# EAGLE schematic RobotRacers_RevQ (EAGLE 9.7.0)

## Sheet 1 of 14: MODULO / ALIMENTACION / ARRANQUE
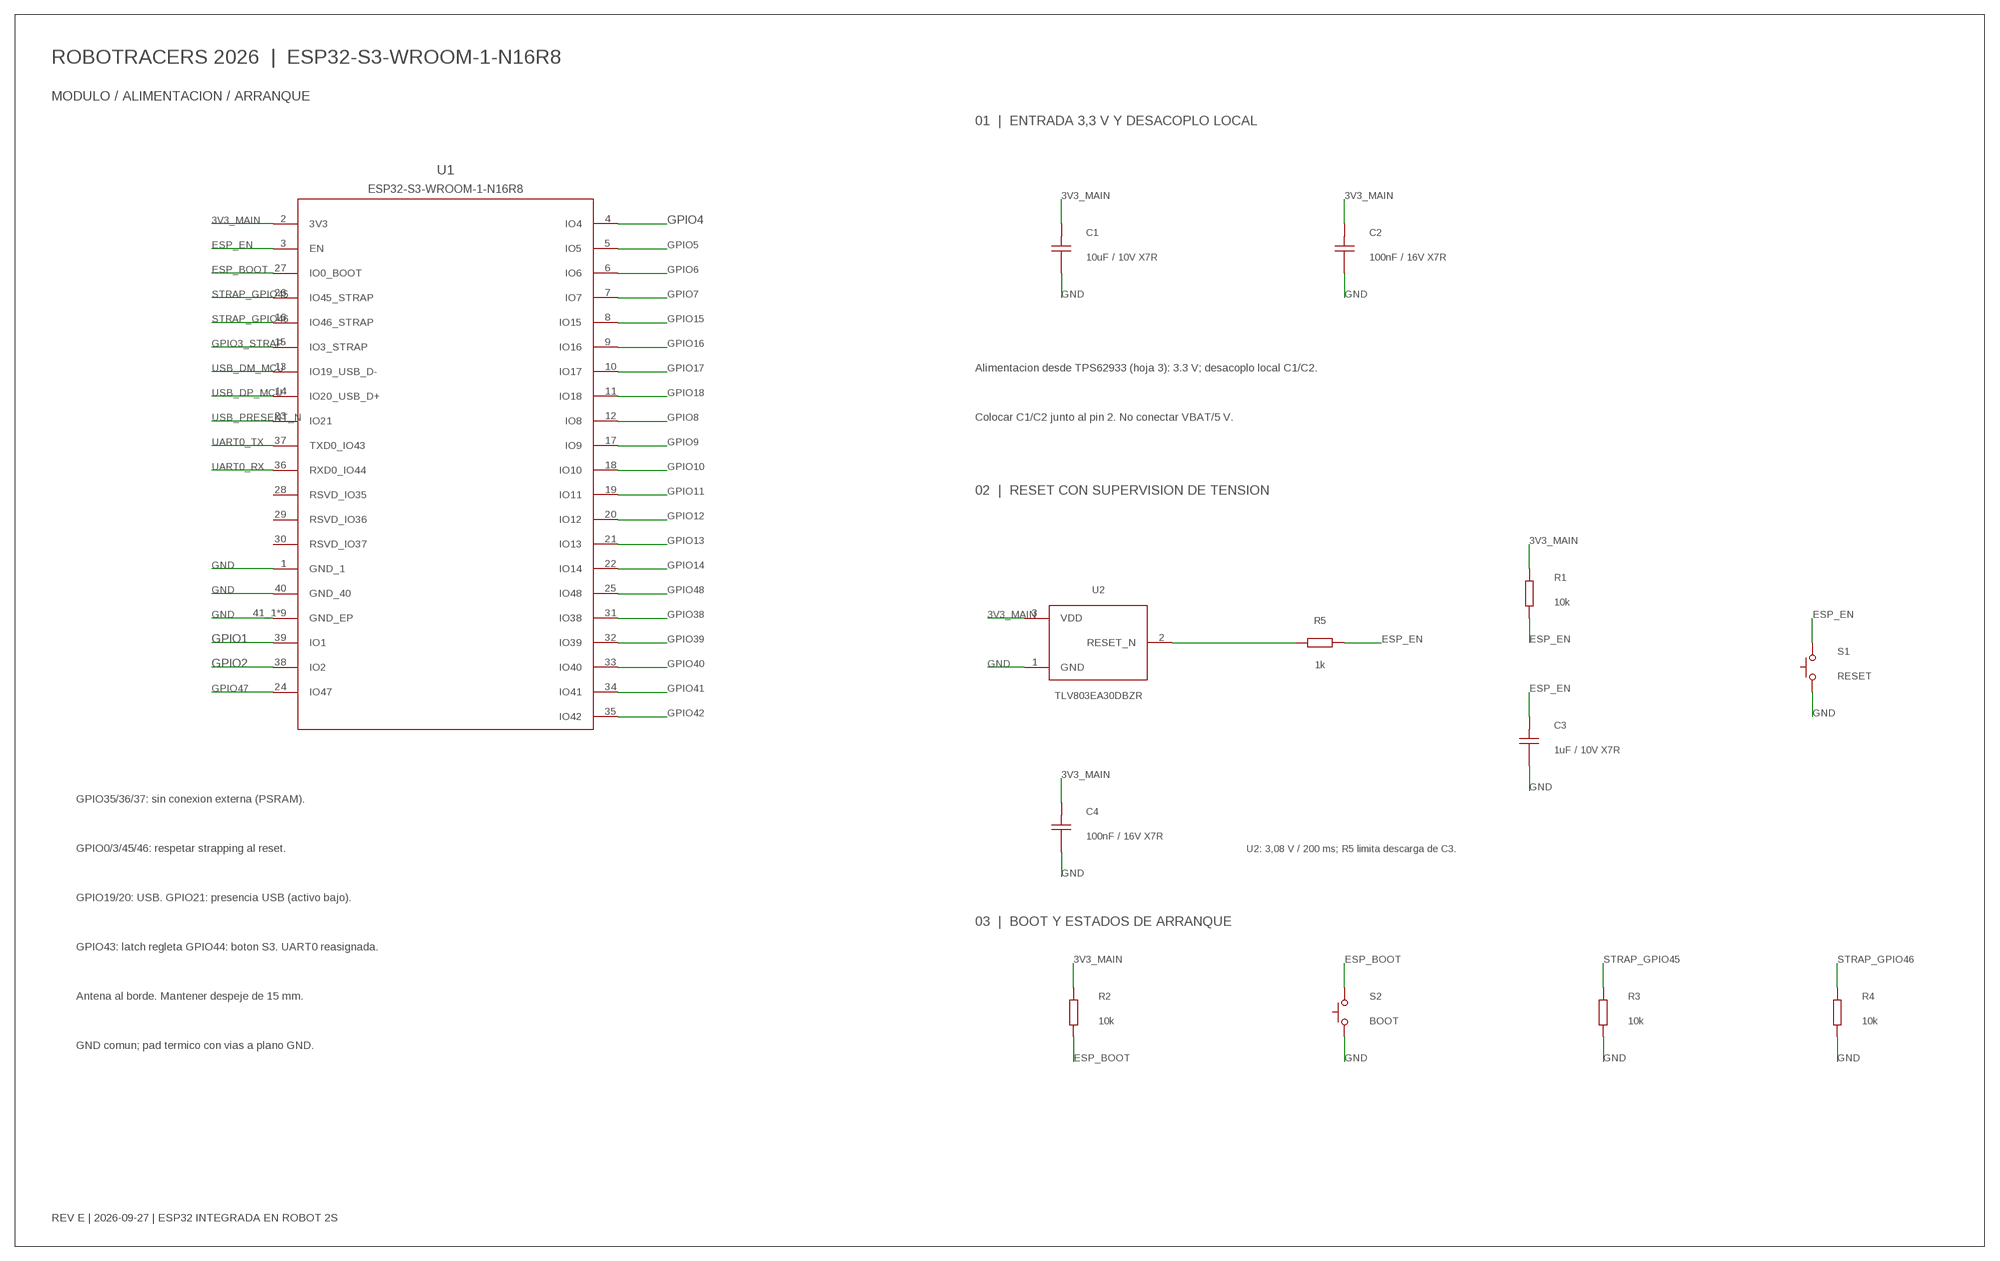
[diagram p0: schematic, sheet 1]

### Parts
C1  10uF / 10V X7R  C0805  [CAPC2012X110]
C2  100nF / 16V X7R  C0603  [CAPC1608X85]
C3  1uF / 10V X7R  C0603  [CAPC1608X85]
C4  100nF / 16V X7R  C0603  [CAPC1608X85]
R1  10k  R0603  [RESC1608X60]
R2  10k  R0603  [RESC1608X60]
R3  10k  R0603  [RESC1608X60]
R4  10k  R0603  [RESC1608X60]
R5  1k  R0603  [RESC1608X60]
S1  RESET  B3U-1000PM  [B3U-1000P(M)]
S2  BOOT  B3U-1000PM  [B3U-1000P(M)]
U1  ESP32-S3-WROOM-1-N16R8  [ESP32-S3-WROOM-1]
U2  TLV803EA30DBZR  [SOT95P237X112-3N]

### Nets
3V3_MAIN: C1.2 C2.2 C4.2 R1.2 R2.2 U1.2(3V3) U2.3(VDD) ; also sheet 2,3,5,6,10,11,12,13,14
ESP_BOOT: R2.1 S2.2 U1.27(IO0_BOOT)
ESP_EN: C3.2 R1.1 R5.2 S1.2 U1.3(EN) ; also sheet 11
GND: C1.1 C2.1 C3.1 C4.1 R3.1 R4.1 S1.1 S2.1 U1.1(GND_1) U1.40(GND_40) U1.41_1(GND_EP) U1.41_2(GND_EP) U1.41_3(GND_EP) U1.41_4(GND_EP) U1.41_5(GND_EP) U1.41_6(GND_EP) U1.41_7(GND_EP) U1.41_8(GND_EP) U1.41_9(GND_EP) U2.1(GND) ; also sheet 2,3,4,5,6,7,8,9,10,11,12,13,14
GPIO1: U1.39(IO1) ; also sheet 14
GPIO2: U1.38(IO2) ; also sheet 14
GPIO3_STRAP: U1.15(IO3_STRAP) ; also sheet 12
GPIO4: U1.4(IO4) ; also sheet 14
GPIO5: U1.5(IO5) ; also sheet 5
GPIO6: U1.6(IO6) ; also sheet 5
GPIO7: U1.7(IO7) ; also sheet 5
GPIO8: U1.12(IO8) ; also sheet 6
GPIO9: U1.17(IO9) ; also sheet 6
GPIO10: U1.18(IO10) ; also sheet 6
GPIO11: U1.19(IO11) ; also sheet 6
GPIO12: U1.20(IO12) ; also sheet 7
GPIO13: U1.21(IO13) ; also sheet 5
GPIO14: U1.22(IO14) ; also sheet 6
GPIO15: U1.8(IO15) ; also sheet 5
GPIO16: U1.9(IO16) ; also sheet 5
GPIO17: U1.10(IO17) ; also sheet 6
GPIO18: U1.11(IO18) ; also sheet 6
GPIO38: U1.31(IO38) ; also sheet 10
GPIO39: U1.32(IO39) ; also sheet 10
GPIO40: U1.33(IO40) ; also sheet 4,8,10
GPIO41: U1.34(IO41) ; also sheet 4,8,10
GPIO42: U1.35(IO42)
GPIO47: U1.24(IO47) ; also sheet 5
GPIO48: U1.25(IO48) ; also sheet 12
RESET_SUP_N: R5.1 U2.2(RESET_N)
STRAP_GPIO45: R3.2 U1.26(IO45_STRAP) ; also sheet 12
STRAP_GPIO46: R4.2 U1.16(IO46_STRAP)
UART0_RX: U1.36(RXD0_IO44) ; also sheet 12
UART0_TX: U1.37(TXD0_IO43) ; also sheet 11
USB_DM_MCU: U1.13(IO19_USB_D-) ; also sheet 2
USB_DP_MCU: U1.14(IO20_USB_D+) ; also sheet 2
USB_PRESENT_N: U1.23(IO21) ; also sheet 2
Unconnected: U1.28(RSVD_IO35) U1.29(RSVD_IO36) U1.30(RSVD_IO37)

### Notes on the sheet
- ROBOTRACERS 2026  |  ESP32-S3-WROOM-1-N16R8
- MODULO / ALIMENTACION / ARRANQUE
- 01  |  ENTRADA 3,3 V Y DESACOPLO LOCAL
- Alimentacion desde TPS62933 (hoja 3): 3.3 V; desacoplo local C1/C2.
- Colocar C1/C2 junto al pin 2. No conectar VBAT/5 V.
- 02  |  RESET CON SUPERVISION DE TENSION
- GPIO35/36/37: sin conexion externa (PSRAM).
- GPIO0/3/45/46: respetar strapping al reset. | U2: 3,08 V / 200 ms; R5 limita descarga de C3.
- GPIO19/20: USB. GPIO21: presencia USB (activo bajo).
- 03  |  BOOT Y ESTADOS DE ARRANQUE
- GPIO43: latch regleta GPIO44: boton S3. UART0 reasignada.
- Antena al borde. Mantener despeje de 15 mm.
- GND comun; pad termico con vias a plano GND.
- REV E | 2026-09-27 | ESP32 INTEGRADA EN ROBOT 2S

## Sheet 2 of 14: USB-C / PROTECCION / DETECCION VBUS
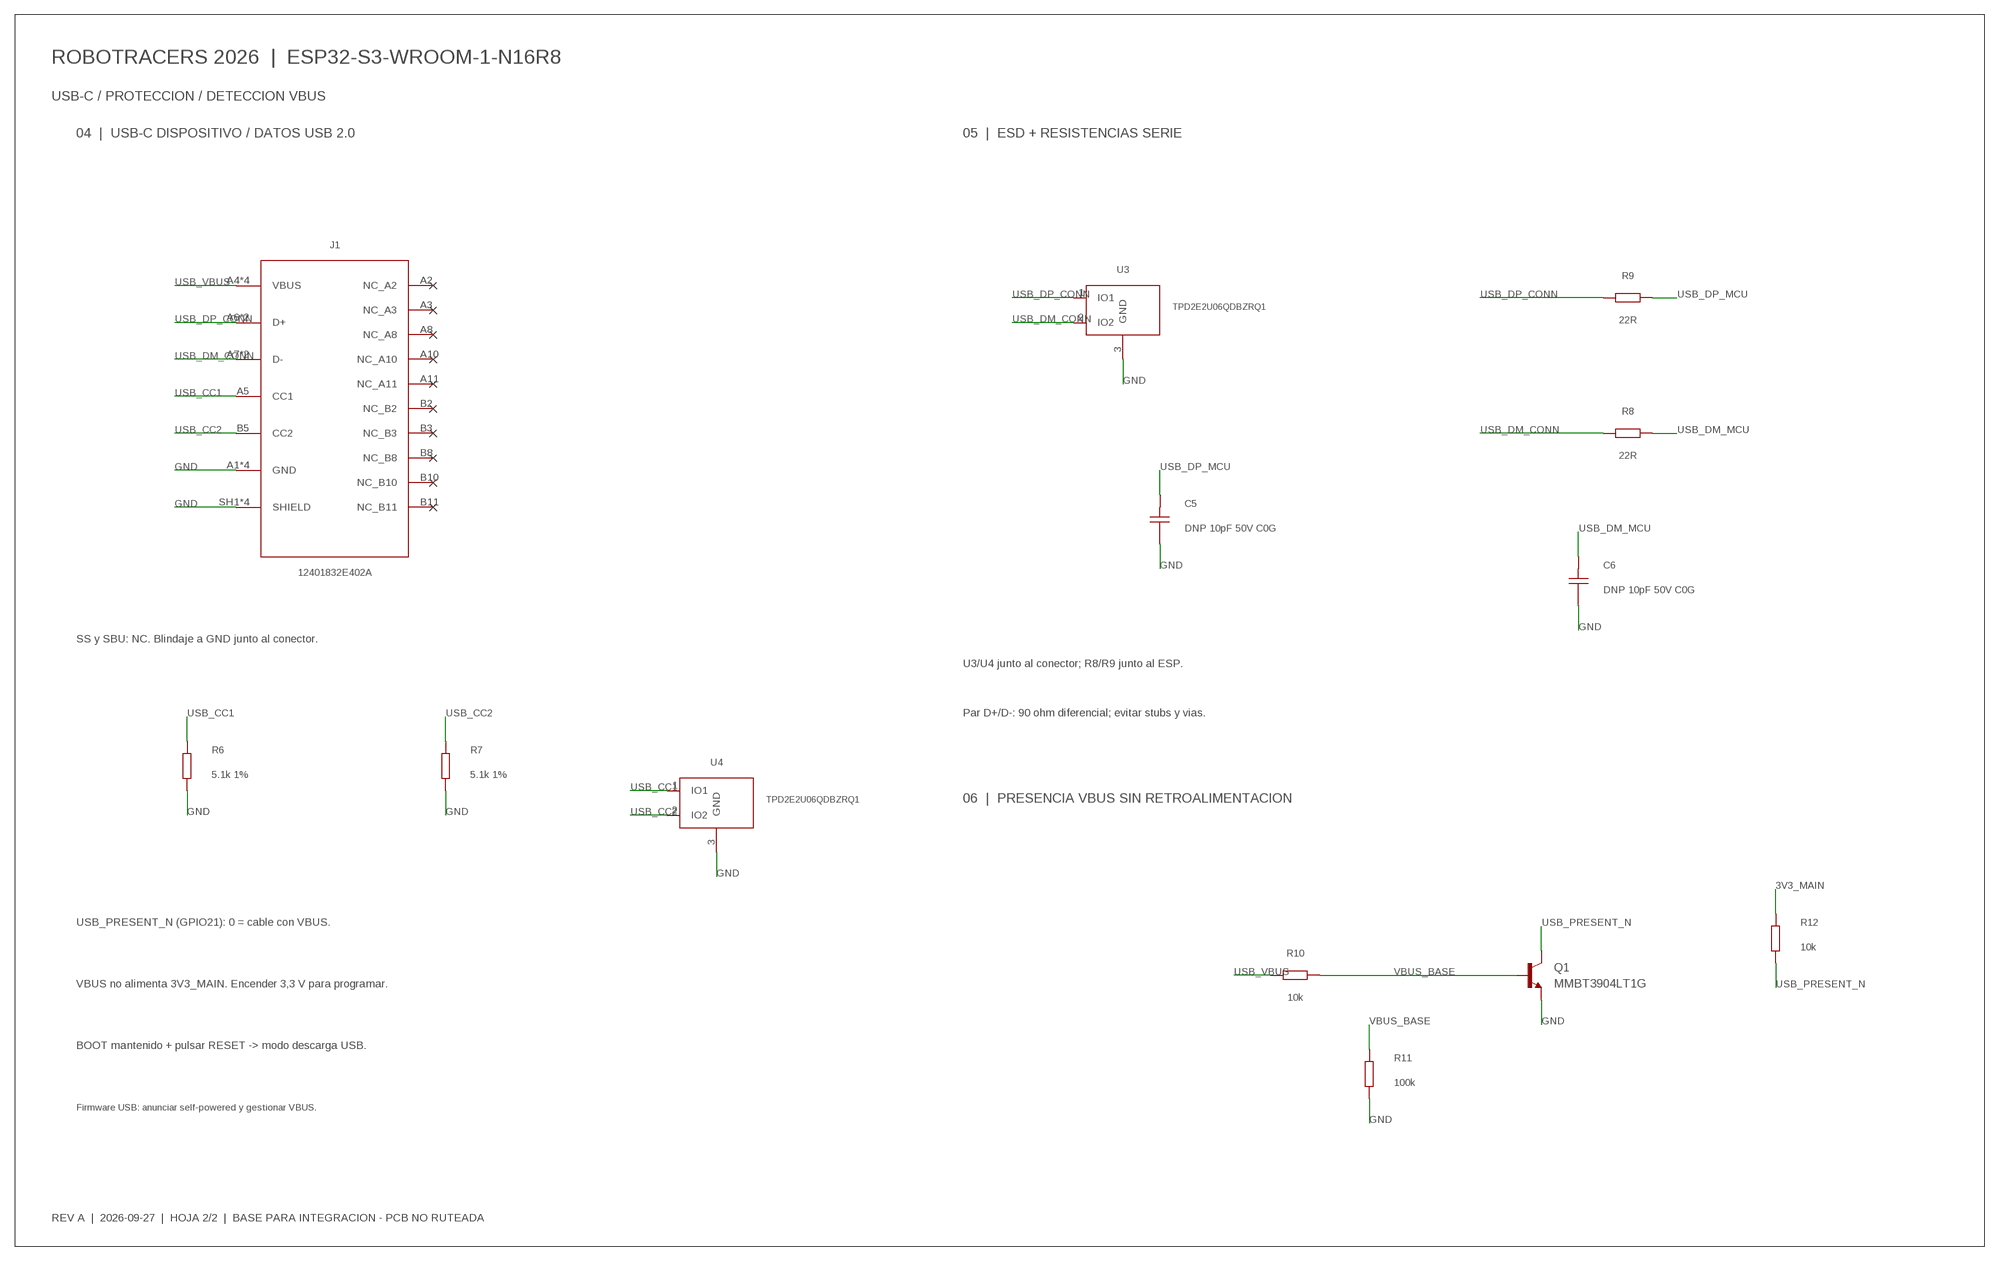
[diagram p1: schematic, sheet 2]

### Parts
C5  DNP 10pF 50V C0G  C0603  [CAPC1608X85]
C6  DNP 10pF 50V C0G  C0603  [CAPC1608X85]
J1  12401832E402A  [12401832E402A]
Q1  MMBT3904LT1G  [SOT95P237X112-3N]
R6  5.1k 1%  R0603  [RESC1608X60]
R7  5.1k 1%  R0603  [RESC1608X60]
R8  22R  R0603  [RESC1608X60]
R9  22R  R0603  [RESC1608X60]
R10  10k  R0603  [RESC1608X60]
R11  100k  R0603  [RESC1608X60]
R12  10k  R0603  [RESC1608X60]
U3  TPD2E2U06QDBZRQ1  [SOT95P237X112-3N]
U4  TPD2E2U06QDBZRQ1  [SOT95P237X112-3N]

### Nets
3V3_MAIN: R12.2 ; also sheet 1,3,5,6,10,11,12,13,14
GND: C5.1 C6.1 J1.A1(GND) J1.A12(GND) J1.B1(GND) J1.B12(GND) J1.SH1(SHIELD) J1.SH2(SHIELD) J1.SH3(SHIELD) J1.SH4(SHIELD) Q1.2(E) R6.1 R7.1 R11.1 U3.3(GND) U4.3(GND) ; also sheet 1,3,4,5,6,7,8,9,10,11,12,13,14
USB_CC1: J1.A5(CC1) R6.2 U4.1(IO1)
USB_CC2: J1.B5(CC2) R7.2 U4.2(IO2)
USB_DM_CONN: J1.A7(D-) J1.B7(D-) R8.1 U3.2(IO2)
USB_DM_MCU: C6.2 R8.2 ; also sheet 1
USB_DP_CONN: J1.A6(D+) J1.B6(D+) R9.1 U3.1(IO1)
USB_DP_MCU: C5.2 R9.2 ; also sheet 1
USB_PRESENT_N: Q1.3(C) R12.1 ; also sheet 1
USB_VBUS: J1.A4(VBUS) J1.A9(VBUS) J1.B4(VBUS) J1.B9(VBUS) R10.1 ; also sheet 13
VBUS_BASE: Q1.1(B) R10.2 R11.2
Unconnected: J1.A2(NC_A2) J1.A3(NC_A3) J1.A8(NC_A8) J1.A10(NC_A10) J1.A11(NC_A11) J1.B2(NC_B2) J1.B3(NC_B3) J1.B8(NC_B8) J1.B10(NC_B10) J1.B11(NC_B11)

### Notes on the sheet
- ROBOTRACERS 2026  |  ESP32-S3-WROOM-1-N16R8
- USB-C / PROTECCION / DETECCION VBUS
- 04  |  USB-C DISPOSITIVO / DATOS USB 2.0 | 05  |  ESD + RESISTENCIAS SERIE
- SS y SBU: NC. Blindaje a GND junto al conector.
- U3/U4 junto al conector; R8/R9 junto al ESP.
- Par D+/D-: 90 ohm diferencial; evitar stubs y vias.
- 06  |  PRESENCIA VBUS SIN RETROALIMENTACION
- USB_PRESENT_N (GPIO21): 0 = cable con VBUS.
- VBUS no alimenta 3V3_MAIN. Encender 3,3 V para programar.
- BOOT mantenido + pulsar RESET -> modo descarga USB.
- Firmware USB: anunciar self-powered y gestionar VBUS.
- REV A  |  2026-09-27  |  HOJA 2/2  |  BASE PARA INTEGRACION - PCB NO RUTEADA

## Sheet 3 of 14: 3V3 ESP32 / BATERIA 2S
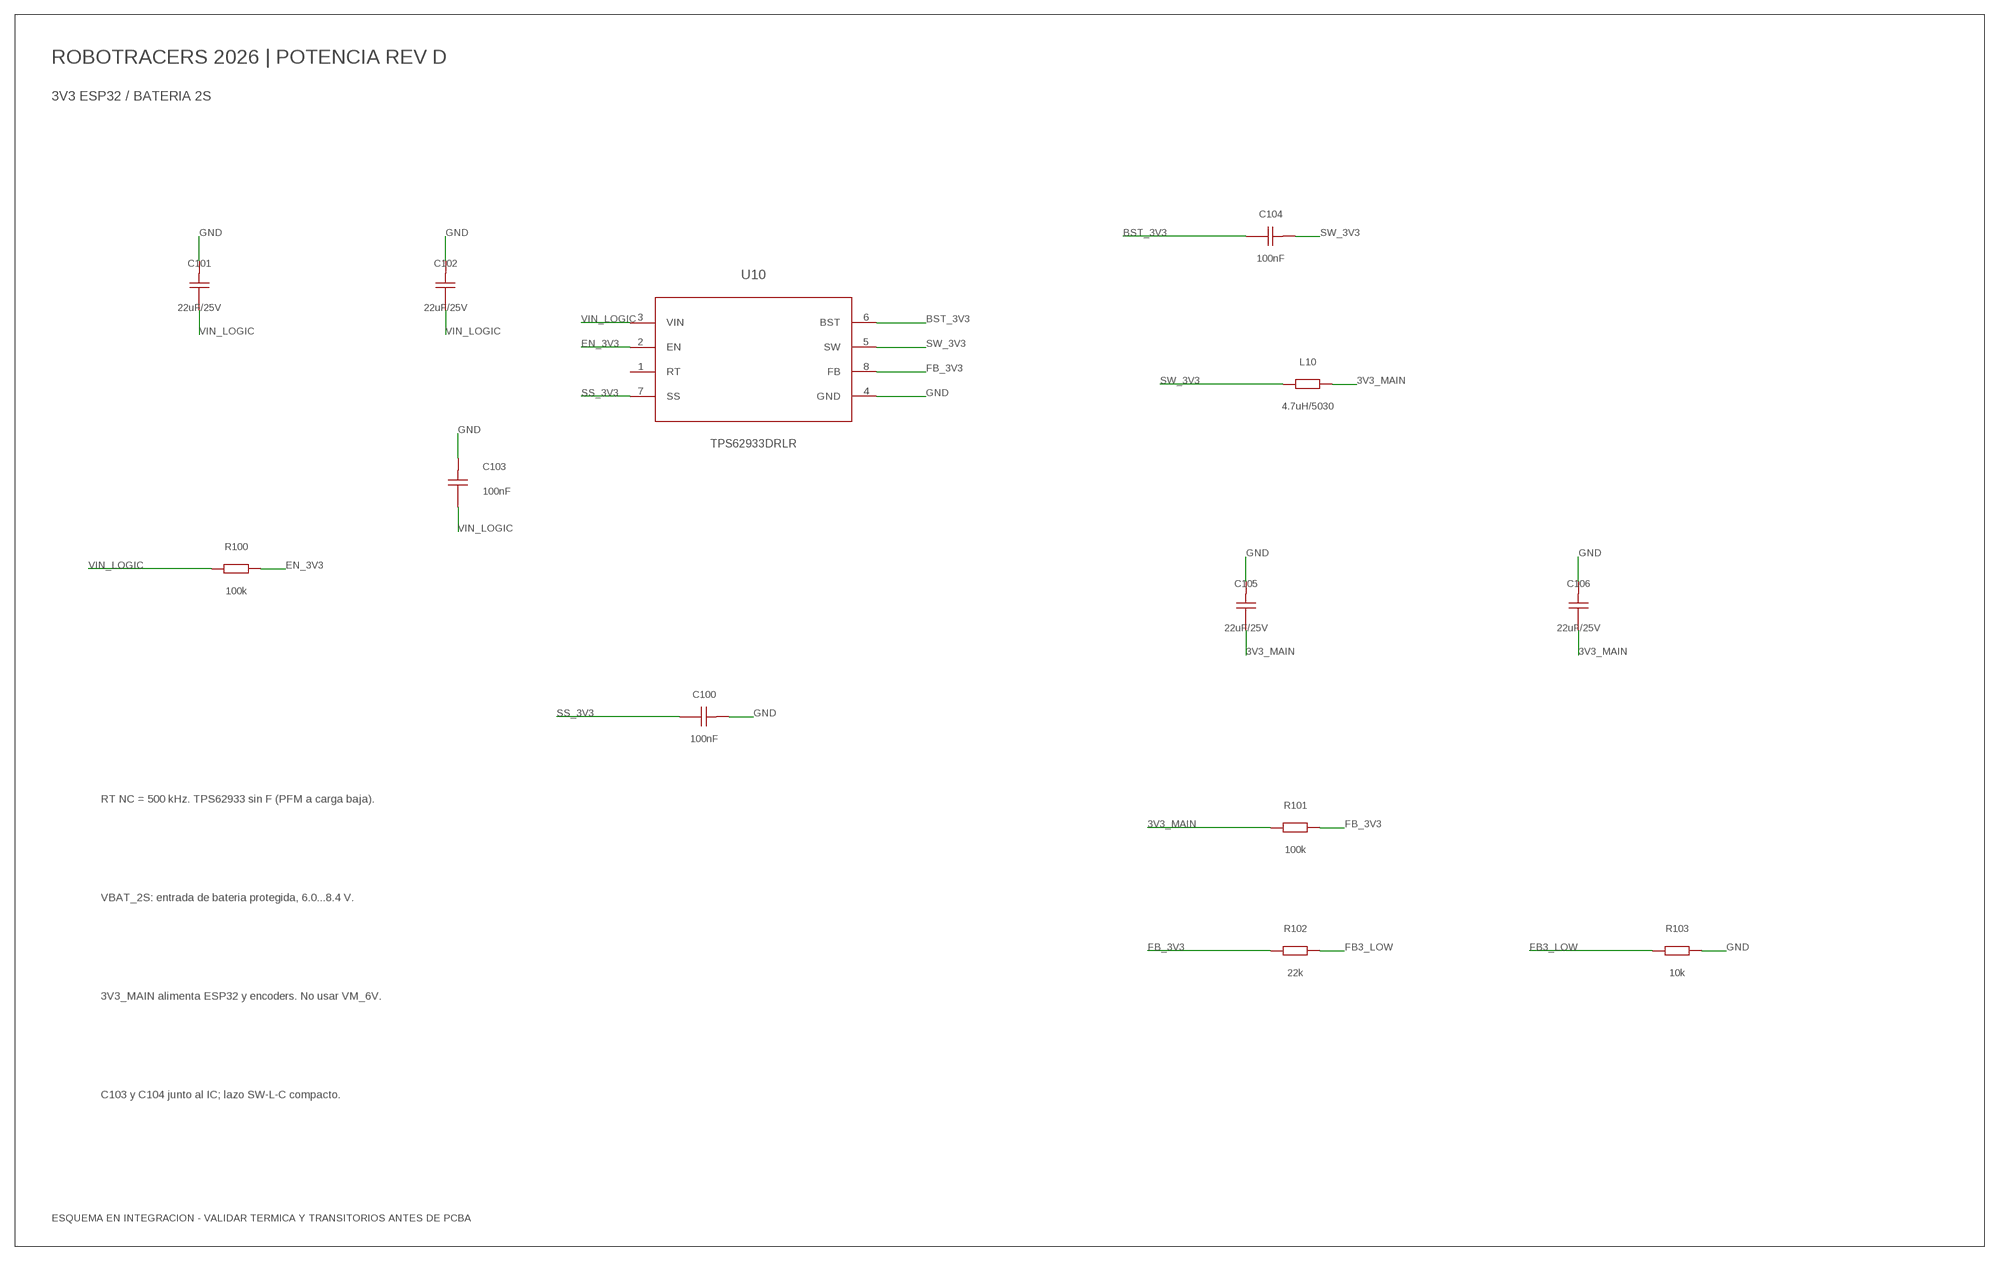
[diagram p2: schematic, sheet 3]

### Parts
C100  100nF  C0603  [CAPC1608X85]
C101  22uF/25V  C1206  [CAPC3216X135]
C102  22uF/25V  C1206  [CAPC3216X135]
C103  100nF  C0603  [CAPC1608X85]
C104  100nF  C0603  [CAPC1608X85]
C105  22uF/25V  C1206  [CAPC3216X135]
C106  22uF/25V  C1206  [CAPC3216X135]
L10  4.7uH/5030  L5030  [YSPI0530_REVN]
R100  100k  R0603  [RESC1608X60]
R101  100k  R0603  [RESC1608X60]
R102  22k  R0603  [RESC1608X60]
R103  10k  R0603  [RESC1608X60]
U10  TPS62933DRLR  [TI_DRL0008A]

### Nets
3V3_MAIN: C105.1 C106.1 L10.2 R101.1 ; also sheet 1,2,5,6,10,11,12,13,14
BST_3V3: C104.1 U10.6(BST)
EN_3V3: R100.2 U10.2(EN)
FB3_LOW: R102.2 R103.1
FB_3V3: R101.2 R102.1 U10.8(FB)
GND: C100.2 C101.2 C102.2 C103.2 C105.2 C106.2 R103.2 U10.4(GND) ; also sheet 1,2,4,5,6,7,8,9,10,11,12,13,14
SS_3V3: C100.1 U10.7(SS)
SW_3V3: C104.2 L10.1 U10.5(SW)
VIN_LOGIC: C101.1 C102.1 C103.1 R100.1 U10.3(VIN) ; also sheet 12,13
Unconnected: U10.1(RT)

### Notes on the sheet
- ROBOTRACERS 2026 | POTENCIA REV D
- 3V3 ESP32 / BATERIA 2S
- RT NC = 500 kHz. TPS62933 sin F (PFM a carga baja).
- VBAT_2S: entrada de bateria protegida, 6.0...8.4 V.
- 3V3_MAIN alimenta ESP32 y encoders. No usar VM_6V.
- C103 y C104 junto al IC; lazo SW-L-C compacto.
- ESQUEMA EN INTEGRACION - VALIDAR TERMICA Y TRANSITORIOS ANTES DE PCBA

## Sheet 4 of 14: 6V MOTORES / BUCK-BOOST
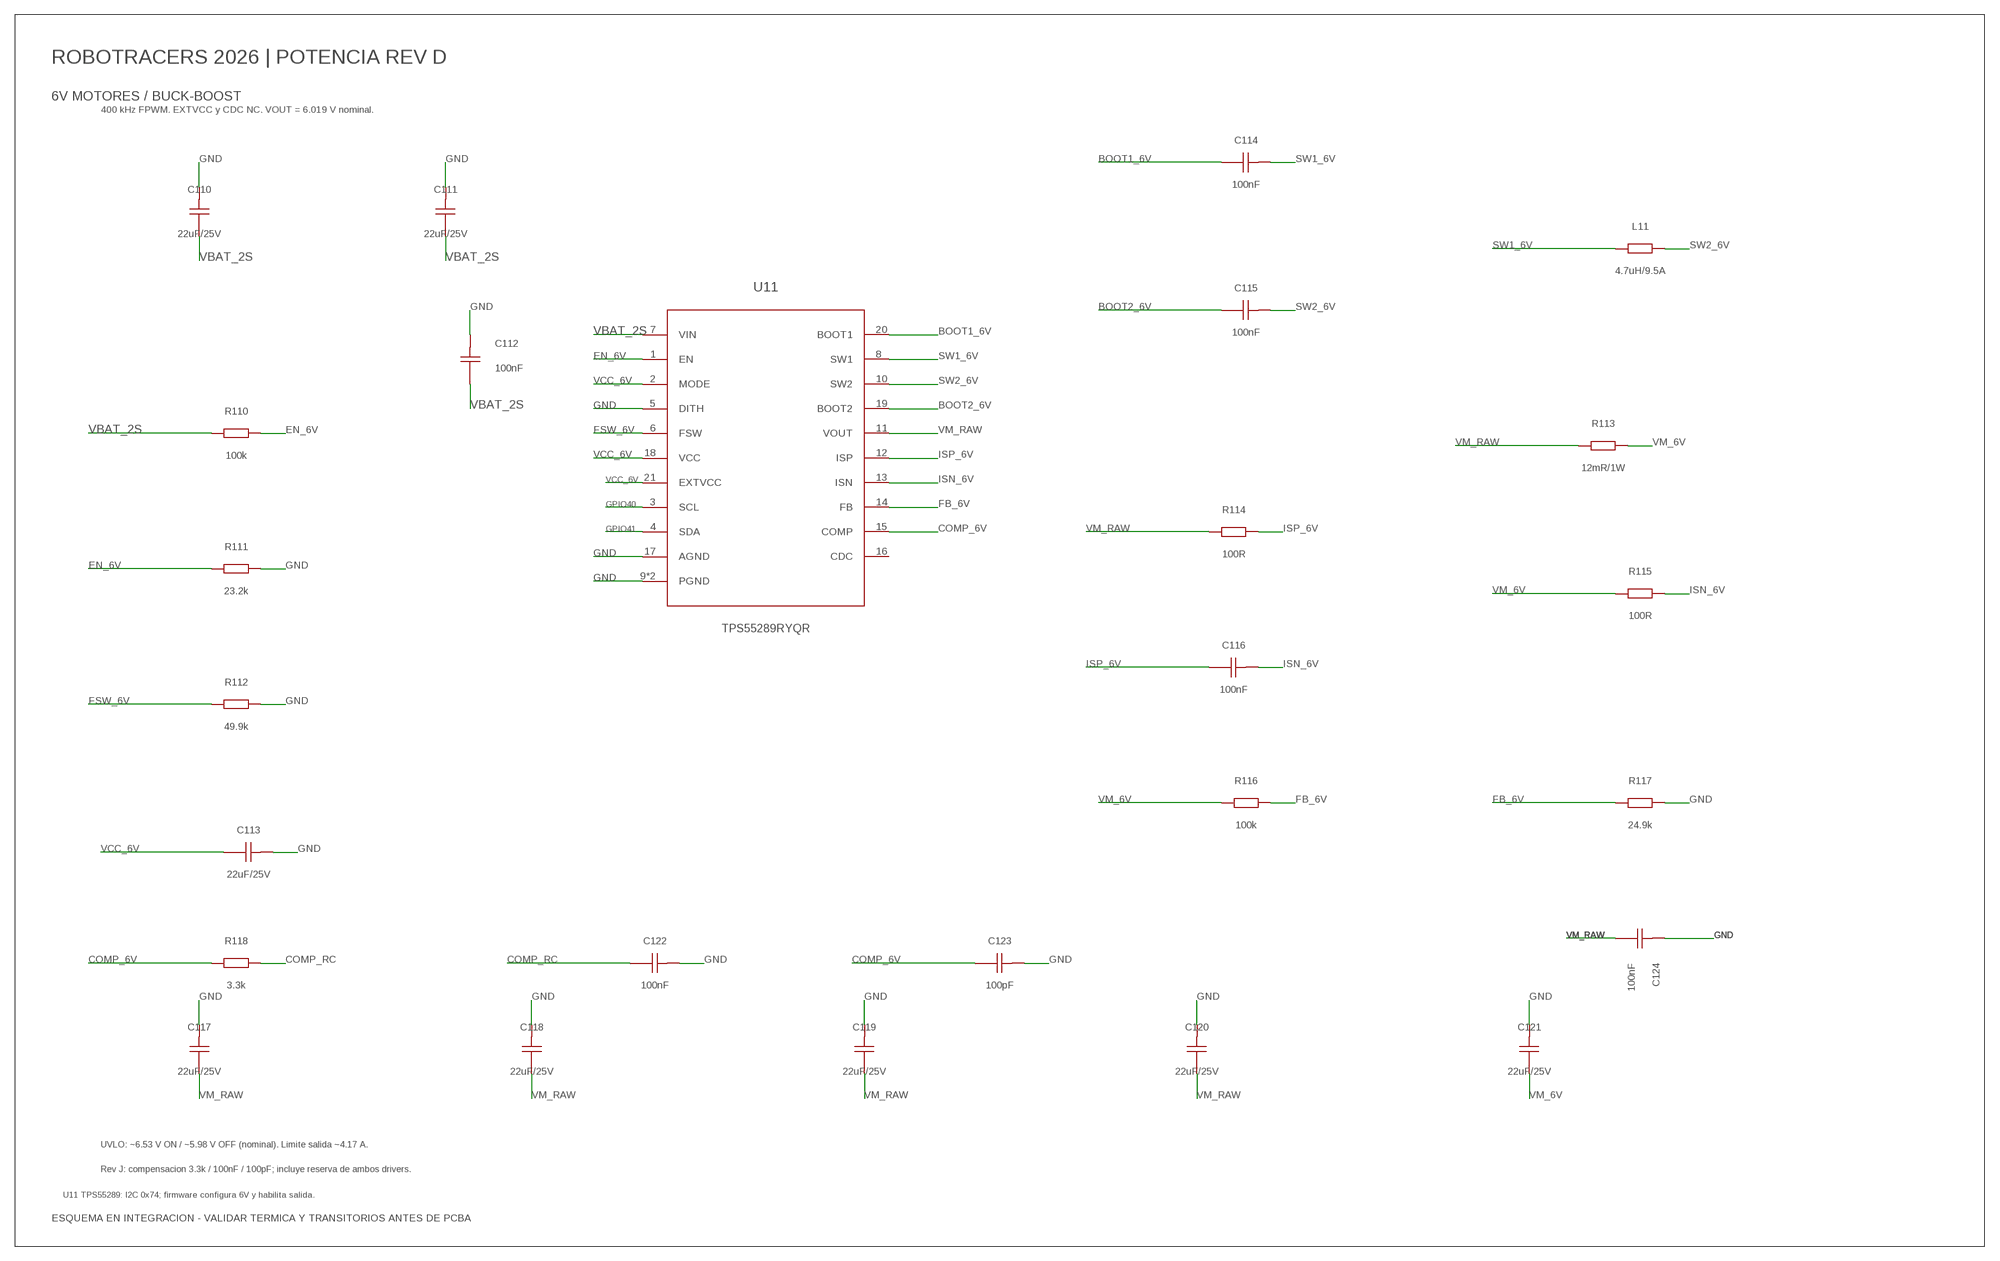
[diagram p3: schematic, sheet 4]

### Parts
C110  22uF/25V  C1206  [CAPC3216X135]
C111  22uF/25V  C1206  [CAPC3216X135]
C112  100nF  C0603  [CAPC1608X85]
C113  22uF/25V  C1206  [CAPC3216X135]
C114  100nF  C0603  [CAPC1608X85]
C115  100nF  C0603  [CAPC1608X85]
C116  100nF  C0603  [CAPC1608X85]
C117  22uF/25V  C1206  [CAPC3216X135]
C118  22uF/25V  C1206  [CAPC3216X135]
C119  22uF/25V  C1206  [CAPC3216X135]
C120  22uF/25V  C1206  [CAPC3216X135]
C121  22uF/25V  C1206  [CAPC3216X135]
C122  100nF  C0402  [CAPC1005_0402]
C123  100pF  C0402  [CAPC1005_0402]
C124  100nF  C0402  [CAPC1005_0402]
L11  4.7uH/9.5A  L7070  [IHLP4040DZ_01_4R7]
R110  100k  R0603  [RESC1608X60]
R111  23.2k  R0603  [RESC1608X60]
R112  49.9k  R0603  [RESC1608X60]
R113  12mR/1W  R1206  [RESC3216X70]
R114  100R  R0603  [RESC1608X60]
R115  100R  R0603  [RESC1608X60]
R116  100k  R0603  [RESC1608X60]
R117  24.9k  R0603  [RESC1608X60]
R118  3.3k  R0402  [RESC1005_0402]
U11  TPS55289RYQR  [TI_RYQ0021A]

### Nets
BOOT1_6V: C114.1 U11.20(BOOT1)
BOOT2_6V: C115.1 U11.19(BOOT2)
COMP_6V: C123.1 R118.1 U11.15(COMP)
COMP_RC: C122.1 R118.2
EN_6V: R110.2 R111.1 U11.1(EN)
FB_6V: R116.2 R117.1 U11.14(FB)
FSW_6V: R112.1 U11.6(FSW)
GND: C110.2 C111.2 C112.2 C113.2 C117.2 C118.2 C119.2 C120.2 C121.2 C122.2 C123.2 C124.2 R111.2 R112.2 R117.2 U11.5(DITH) U11.9(PGND) U11.9A(PGND) U11.17(AGND) ; also sheet 1,2,3,5,6,7,8,9,10,11,12,13,14
GPIO40: U11.3(SCL) ; also sheet 1,8,10
GPIO41: U11.4(SDA) ; also sheet 1,8,10
ISN_6V: C116.2 R115.2 U11.13(ISN)
ISP_6V: C116.1 R114.2 U11.12(ISP)
SW1_6V: C114.2 L11.1 U11.8(SW1)
SW2_6V: C115.2 L11.2 U11.10(SW2)
VBAT_2S: C110.1 C111.1 C112.1 R110.1 U11.7(VIN) ; also sheet 9,13
VCC_6V: C113.1 U11.2(MODE) U11.18(VCC) U11.21(EXTVCC)
VM_6V: C121.1 R113.2 R115.1 R116.1 ; also sheet 5,6,13
VM_RAW: C117.1 C118.1 C119.1 C120.1 C124.1 R113.1 R114.1 U11.11(VOUT)
Unconnected: U11.16(CDC)

### Notes on the sheet
- ROBOTRACERS 2026 | POTENCIA REV D
- 6V MOTORES / BUCK-BOOST
- 400 kHz FPWM. EXTVCC y CDC NC. VOUT = 6.019 V nominal.
- UVLO: ~6.53 V ON / ~5.98 V OFF (nominal). Limite salida ~4.17 A.
- Rev J: compensacion 3.3k / 100nF / 100pF; incluye reserva de ambos drivers.
- U11 TPS55289: I2C 0x74; firmware configura 6V y habilita salida.
- ESQUEMA EN INTEGRACION - VALIDAR TERMICA Y TRANSITORIOS ANTES DE PCBA

## Sheet 5 of 14: MOTOR IZQUIERDO / POLOLU 5178
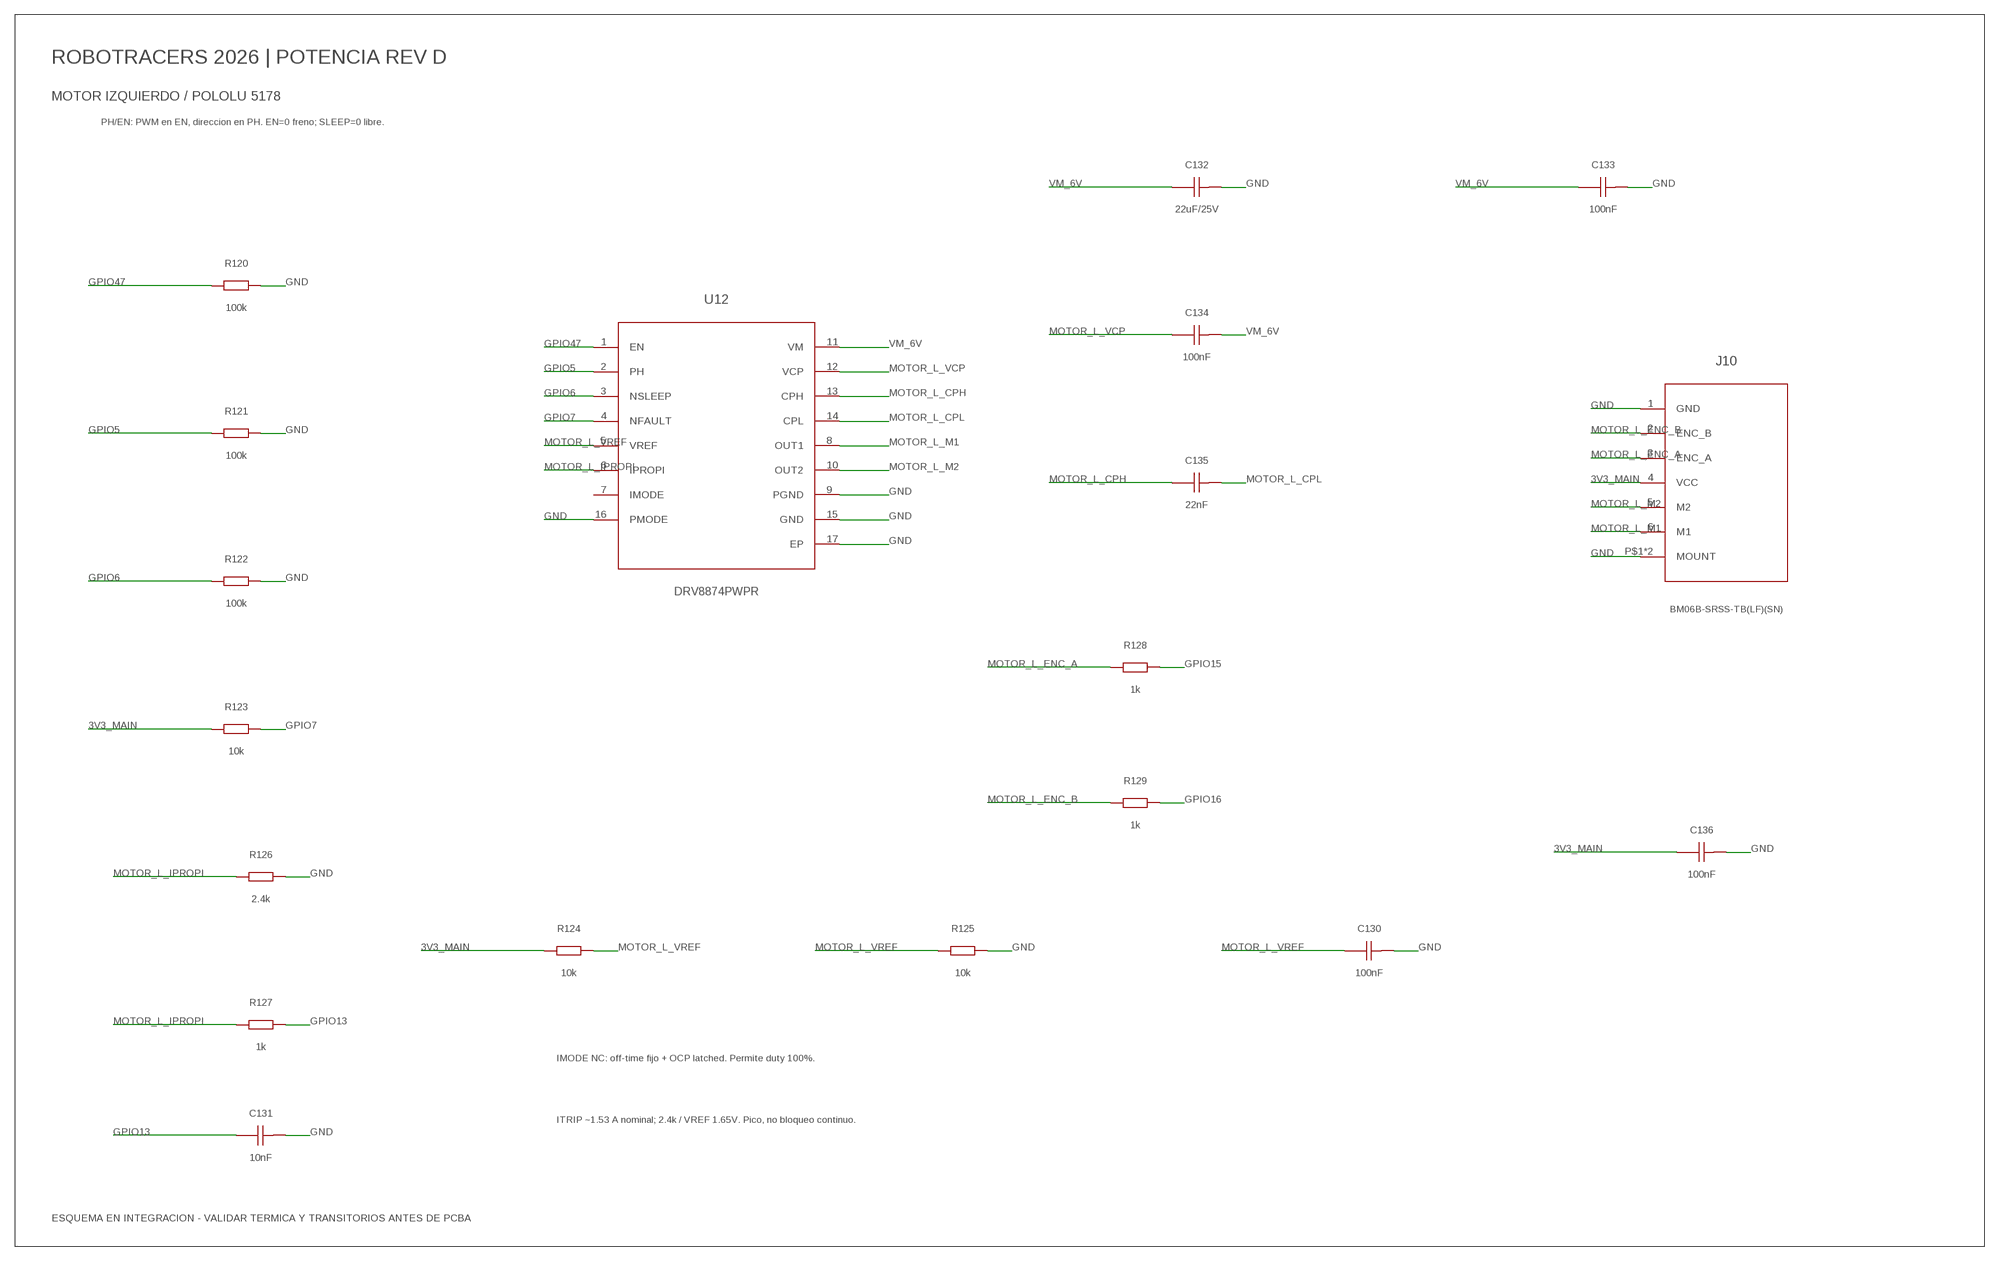
[diagram p4: schematic, sheet 5]

### Parts
C130  100nF  C0603  [CAPC1608X85]
C131  10nF  C0603  [CAPC1608X85]
C132  22uF/25V  C1206  [CAPC3216X135]
C133  100nF  C0603  [CAPC1608X85]
C134  100nF  C0603  [CAPC1608X85]
C135  22nF  C0603  [CAPC1608X85]
C136  100nF  C0603  [CAPC1608X85]
J10  BM06B-SRSS-TB(LF)(SN)  MOTOR_JST  [JST-6-SMD-VERT-1.0MM]
R120  100k  R0603  [RESC1608X60]
R121  100k  R0603  [RESC1608X60]
R122  100k  R0603  [RESC1608X60]
R123  10k  R0603  [RESC1608X60]
R124  10k  R0603  [RESC1608X60]
R125  10k  R0603  [RESC1608X60]
R126  2.4k  R0603  [RESC1608X60]
R127  1k  R0603  [RESC1608X60]
R128  1k  R0603  [RESC1608X60]
R129  1k  R0603  [RESC1608X60]
U12  DRV8874PWPR  [TI_PWP0016J]

### Nets
3V3_MAIN: C136.1 J10.4(VCC) R123.1 R124.1 ; also sheet 1,2,3,6,10,11,12,13,14
GND: C130.2 C131.2 C132.2 C133.2 C136.2 J10.1(GND) J10.P$1(MOUNT) J10.P$2(MOUNT) R120.2 R121.2 R122.2 R125.2 R126.2 U12.9(PGND) U12.15(GND) U12.16(PMODE) U12.17(EP) ; also sheet 1,2,3,4,6,7,8,9,10,11,12,13,14
GPIO5: R121.1 U12.2(PH) ; also sheet 1
GPIO6: R122.1 U12.3(NSLEEP) ; also sheet 1
GPIO7: R123.2 U12.4(NFAULT) ; also sheet 1
GPIO13: C131.1 R127.2 ; also sheet 1
GPIO15: R128.2 ; also sheet 1
GPIO16: R129.2 ; also sheet 1
GPIO47: R120.1 U12.1(EN) ; also sheet 1
MOTOR_L_CPH: C135.1 U12.13(CPH)
MOTOR_L_CPL: C135.2 U12.14(CPL)
MOTOR_L_ENC_A: J10.3(ENC_A) R128.1
MOTOR_L_ENC_B: J10.2(ENC_B) R129.1
MOTOR_L_IPROPI: R126.1 R127.1 U12.6(IPROPI)
MOTOR_L_M1: J10.6(M1) U12.8(OUT1) ; also sheet 13
MOTOR_L_M2: J10.5(M2) U12.10(OUT2) ; also sheet 13
MOTOR_L_VCP: C134.1 U12.12(VCP)
MOTOR_L_VREF: C130.1 R124.2 R125.1 U12.5(VREF)
VM_6V: C132.1 C133.1 C134.2 U12.11(VM) ; also sheet 4,6,13
Unconnected: U12.7(IMODE)

### Notes on the sheet
- ROBOTRACERS 2026 | POTENCIA REV D
- MOTOR IZQUIERDO / POLOLU 5178
- PH/EN: PWM en EN, direccion en PH. EN=0 freno; SLEEP=0 libre.
- IMODE NC: off-time fijo + OCP latched. Permite duty 100%.
- ITRIP ~1.53 A nominal; 2.4k / VREF 1.65V. Pico, no bloqueo continuo.
- ESQUEMA EN INTEGRACION - VALIDAR TERMICA Y TRANSITORIOS ANTES DE PCBA

## Sheet 6 of 14: MOTOR DERECHO / POLOLU 5178
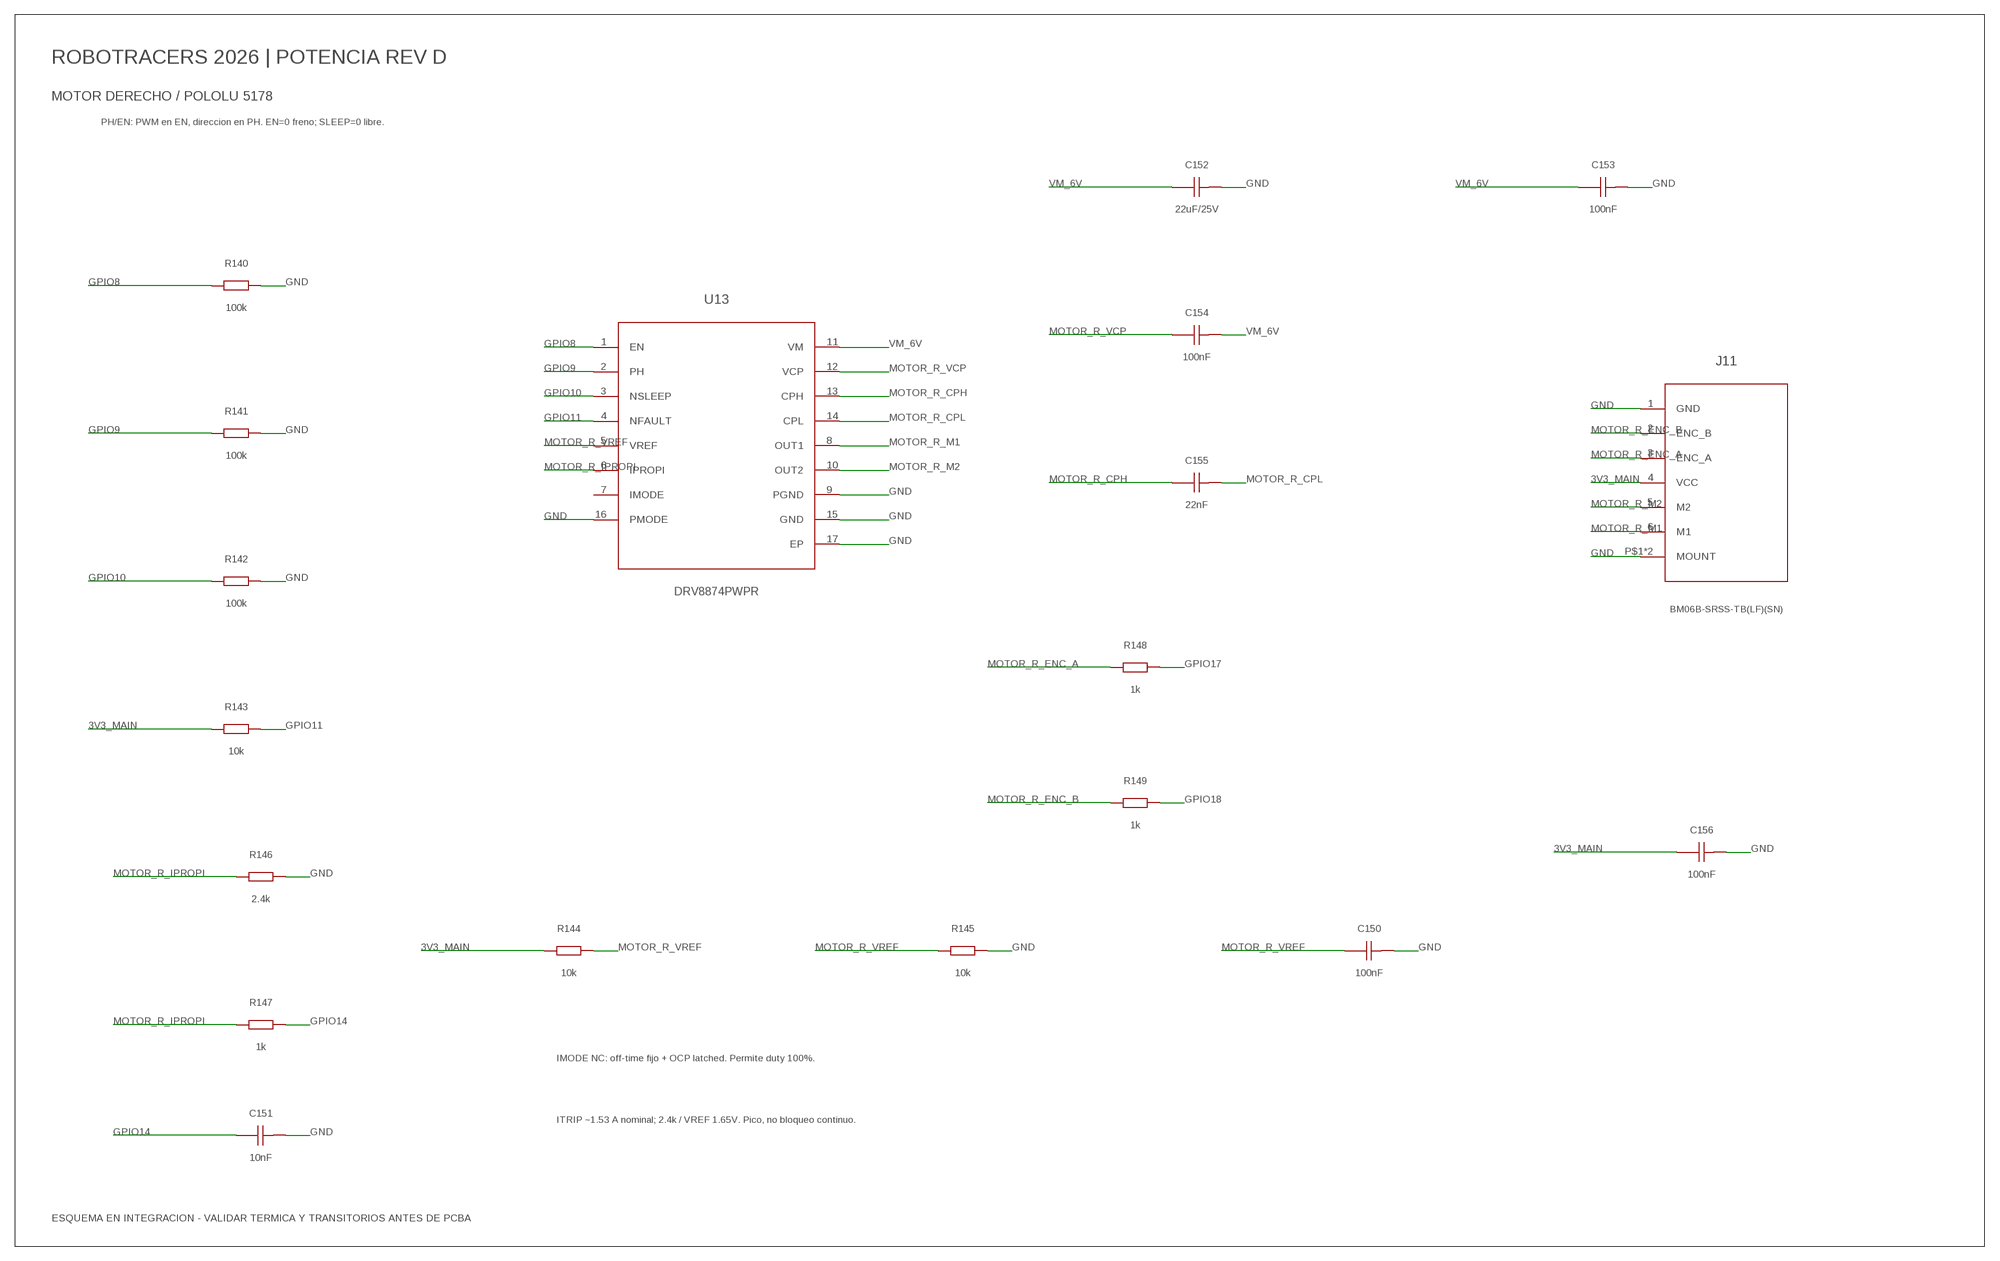
[diagram p5: schematic, sheet 6]

### Parts
C150  100nF  C0603  [CAPC1608X85]
C151  10nF  C0603  [CAPC1608X85]
C152  22uF/25V  C1206  [CAPC3216X135]
C153  100nF  C0603  [CAPC1608X85]
C154  100nF  C0603  [CAPC1608X85]
C155  22nF  C0603  [CAPC1608X85]
C156  100nF  C0603  [CAPC1608X85]
J11  BM06B-SRSS-TB(LF)(SN)  MOTOR_JST  [JST-6-SMD-VERT-1.0MM]
R140  100k  R0603  [RESC1608X60]
R141  100k  R0603  [RESC1608X60]
R142  100k  R0603  [RESC1608X60]
R143  10k  R0603  [RESC1608X60]
R144  10k  R0603  [RESC1608X60]
R145  10k  R0603  [RESC1608X60]
R146  2.4k  R0603  [RESC1608X60]
R147  1k  R0603  [RESC1608X60]
R148  1k  R0603  [RESC1608X60]
R149  1k  R0603  [RESC1608X60]
U13  DRV8874PWPR  [TI_PWP0016J]

### Nets
3V3_MAIN: C156.1 J11.4(VCC) R143.1 R144.1 ; also sheet 1,2,3,5,10,11,12,13,14
GND: C150.2 C151.2 C152.2 C153.2 C156.2 J11.1(GND) J11.P$1(MOUNT) J11.P$2(MOUNT) R140.2 R141.2 R142.2 R145.2 R146.2 U13.9(PGND) U13.15(GND) U13.16(PMODE) U13.17(EP) ; also sheet 1,2,3,4,5,7,8,9,10,11,12,13,14
GPIO8: R140.1 U13.1(EN) ; also sheet 1
GPIO9: R141.1 U13.2(PH) ; also sheet 1
GPIO10: R142.1 U13.3(NSLEEP) ; also sheet 1
GPIO11: R143.2 U13.4(NFAULT) ; also sheet 1
GPIO14: C151.1 R147.2 ; also sheet 1
GPIO17: R148.2 ; also sheet 1
GPIO18: R149.2 ; also sheet 1
MOTOR_R_CPH: C155.1 U13.13(CPH)
MOTOR_R_CPL: C155.2 U13.14(CPL)
MOTOR_R_ENC_A: J11.3(ENC_A) R148.1
MOTOR_R_ENC_B: J11.2(ENC_B) R149.1
MOTOR_R_IPROPI: R146.1 R147.1 U13.6(IPROPI)
MOTOR_R_M1: J11.6(M1) U13.8(OUT1) ; also sheet 13
MOTOR_R_M2: J11.5(M2) U13.10(OUT2) ; also sheet 13
MOTOR_R_VCP: C154.1 U13.12(VCP)
MOTOR_R_VREF: C150.1 R144.2 R145.1 U13.5(VREF)
VM_6V: C152.1 C153.1 C154.2 U13.11(VM) ; also sheet 4,5,13
Unconnected: U13.7(IMODE)

### Notes on the sheet
- ROBOTRACERS 2026 | POTENCIA REV D
- MOTOR DERECHO / POLOLU 5178
- PH/EN: PWM en EN, direccion en PH. EN=0 freno; SLEEP=0 libre.
- IMODE NC: off-time fijo + OCP latched. Permite duty 100%.
- ITRIP ~1.53 A nominal; 2.4k / VREF 1.65V. Pico, no bloqueo continuo.
- ESQUEMA EN INTEGRACION - VALIDAR TERMICA Y TRANSITORIOS ANTES DE PCBA

## Sheet 7 of 14: TURBINA / CONTROL PRELIMINAR - FAN_V_EXT SIN ALIMENTAR
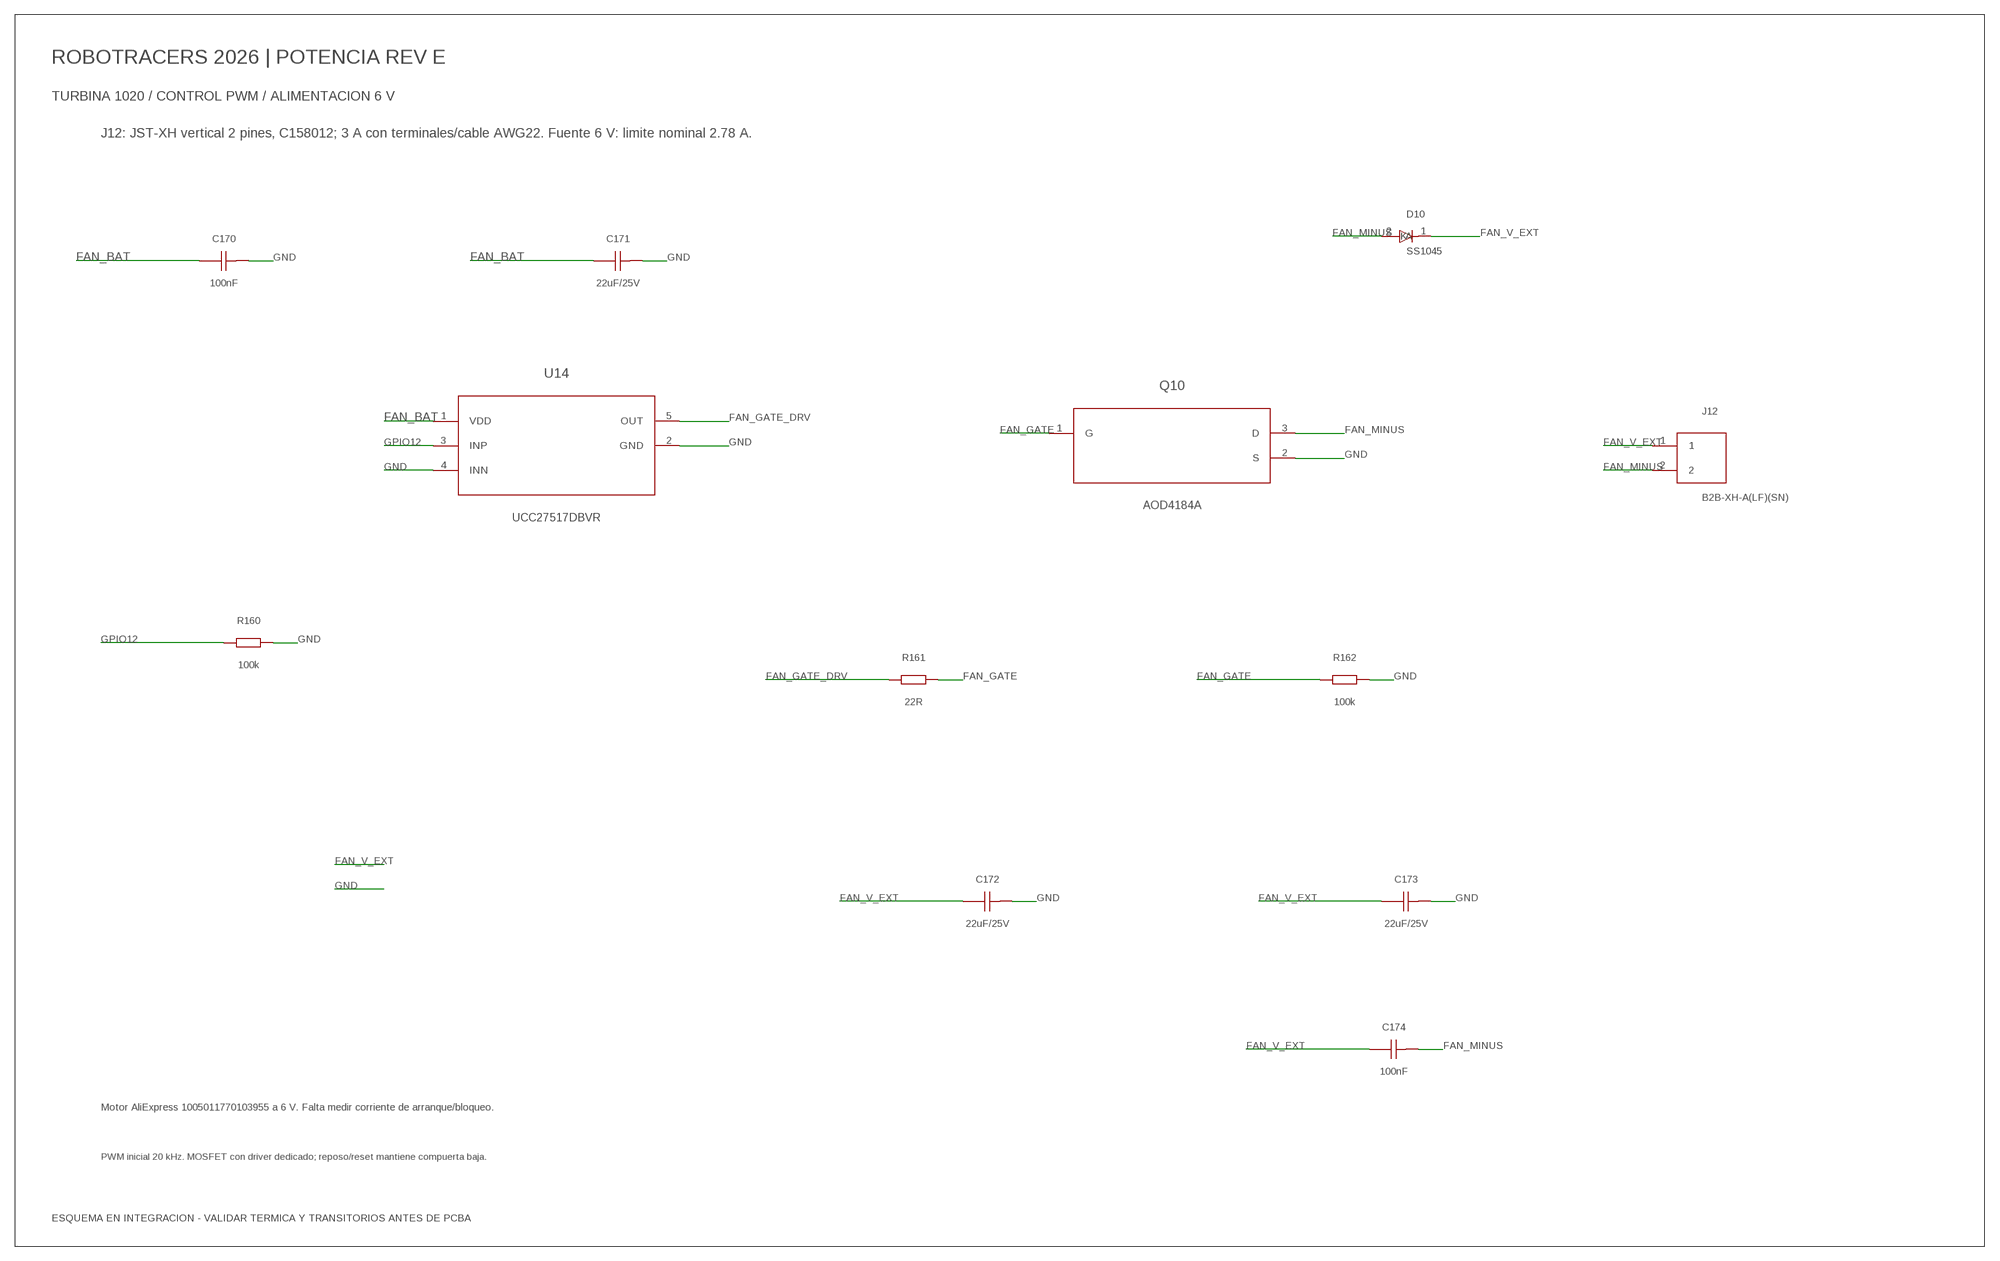
[diagram p6: schematic, sheet 7]

### Parts
C170  100nF  C0603  [CAPC1608X85]
C171  22uF/25V  C1206  [CAPC3216X135]
C172  22uF/25V  C1206  [CAPC3216X135]
C173  22uF/25V  C1206  [CAPC3216X135]
C174  100nF  C0603  [CAPC1608X85]
D10  SS1045  [SMC_DO214AB]
J12  B2B-XH-A(LF)(SN)  POWER_JST  [JST_XH_B2B_VERTICAL]
Q10  AOD4184A  [TO252]
R160  100k  R0603  [RESC1608X60]
R161  22R  R0603  [RESC1608X60]
R162  100k  R0603  [RESC1608X60]
U14  UCC27517DBVR  [SOT95P280X145-5N]

### Nets
FAN_BAT: C170.1 C171.1 U14.1(VDD) ; also sheet 8,9
FAN_GATE: Q10.1(G) R161.2 R162.1
FAN_GATE_DRV: R161.1 U14.5(OUT)
FAN_MINUS: C174.2 D10.2(A) J12.2 Q10.3(D)
FAN_V_EXT: C172.1 C173.1 C174.1 D10.1(K) J12.1 ; also sheet 8
GND: C170.2 C171.2 C172.2 C173.2 Q10.2(S) R160.2 R162.2 U14.2(GND) U14.4(INN) ; also sheet 1,2,3,4,5,6,8,9,10,11,12,13,14
GPIO12: R160.1 U14.3(INP) ; also sheet 1

### Notes on the sheet
- ROBOTRACERS 2026 | POTENCIA REV E
- TURBINA 1020 / CONTROL PWM / ALIMENTACION 6 V
- J12: JST-XH vertical 2 pines, C158012; 3 A con terminales/cable AWG22. Fuente 6 V: limite nominal 2.78 A.
- Motor AliExpress 1005011770103955 a 6 V. Falta medir corriente de arranque/bloqueo.
- PWM inicial 20 kHz. MOSFET con driver dedicado; reposo/reset mantiene compuerta baja.
- ESQUEMA EN INTEGRACION - VALIDAR TERMICA Y TRANSITORIOS ANTES DE PCBA

## Sheet 8 of 14: 6V TURBINA / CORRIENTE DE CARGA PENDIENTE DE MEDIR
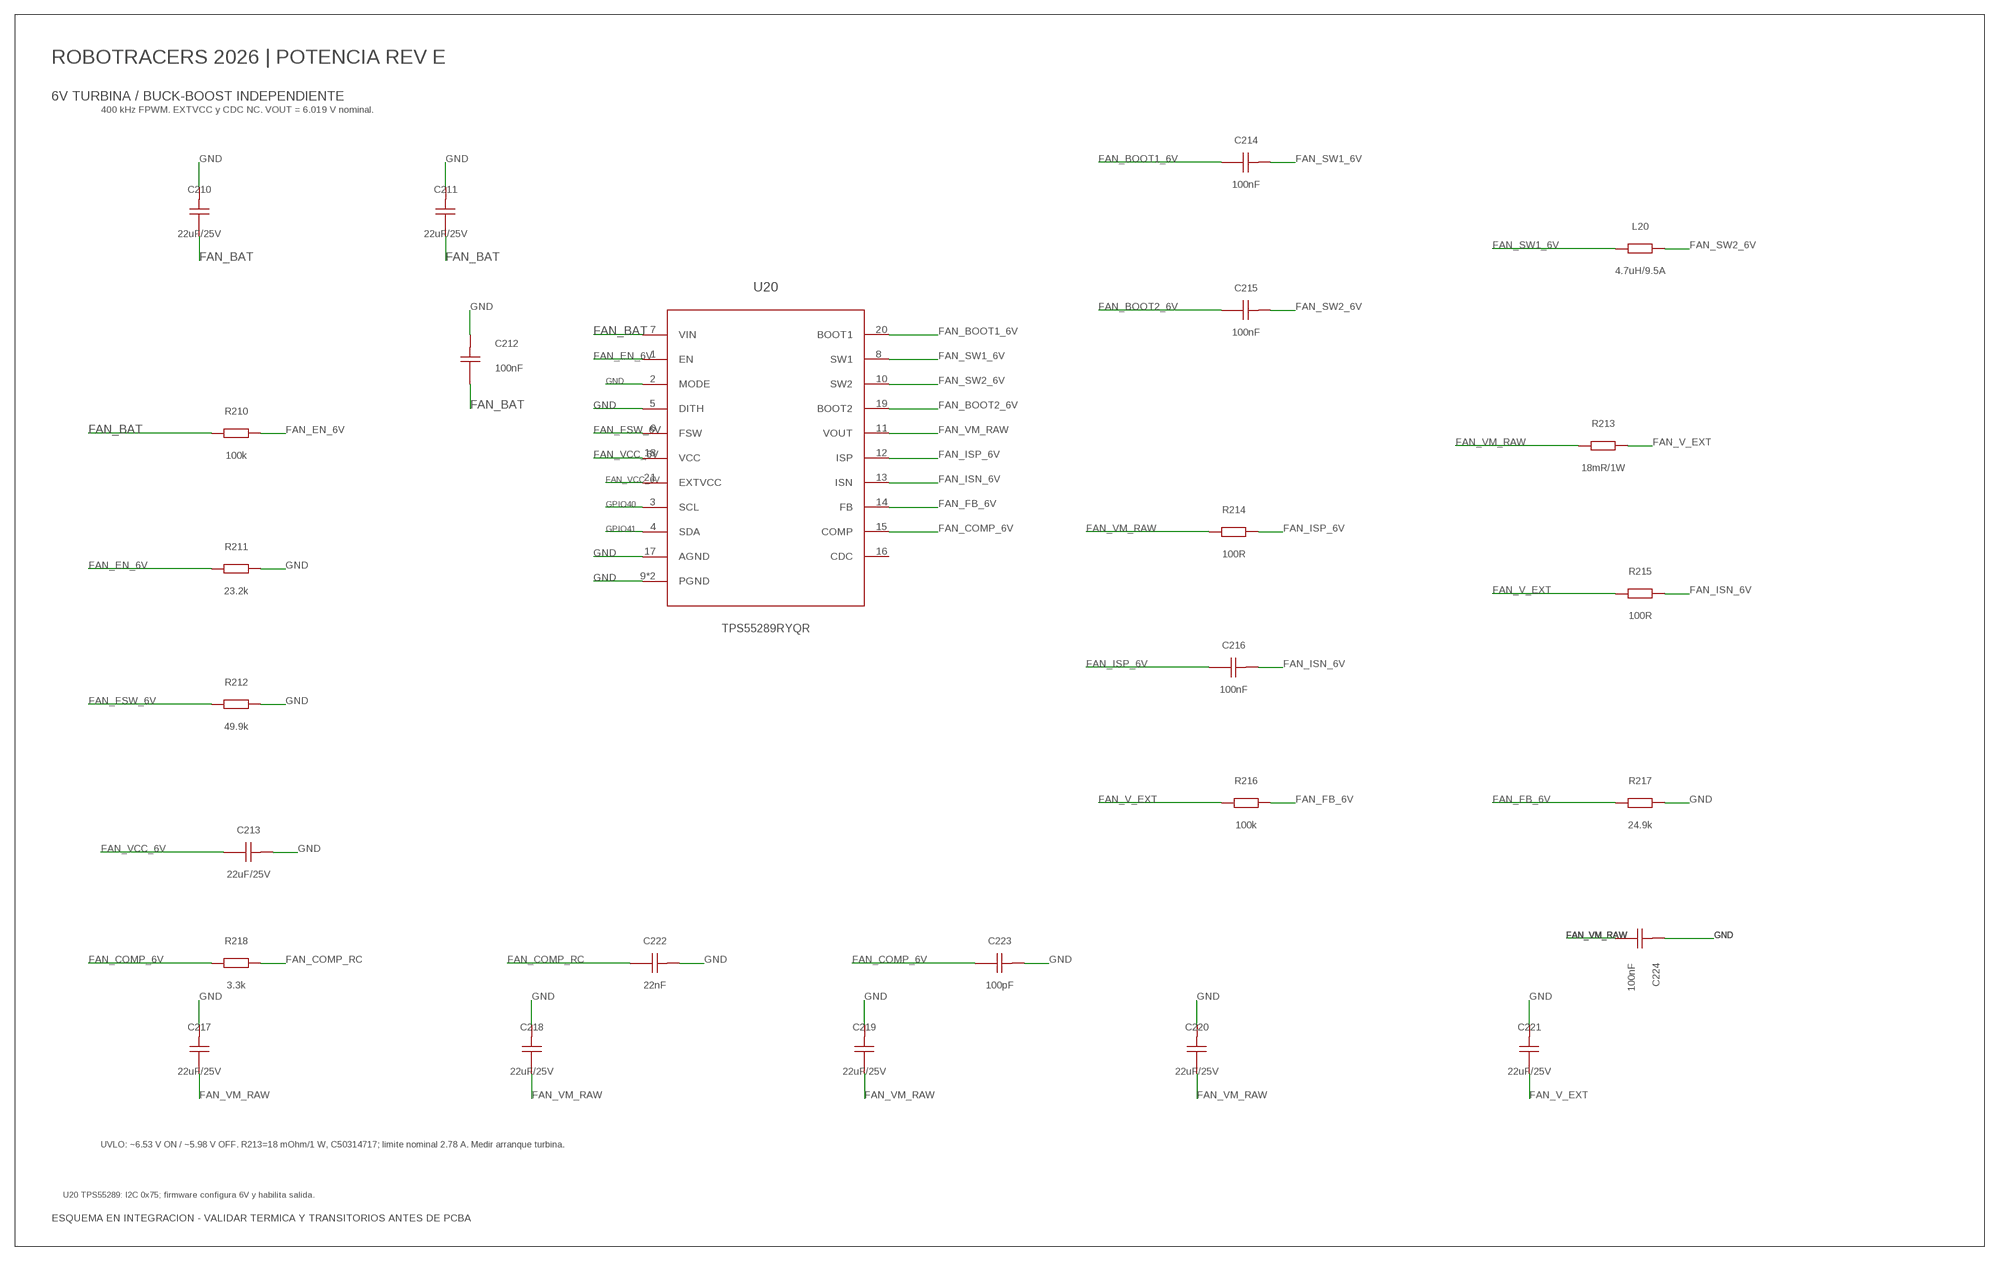
[diagram p7: schematic, sheet 8]

### Parts
C210  22uF/25V  C1206  [CAPC3216X135]
C211  22uF/25V  C1206  [CAPC3216X135]
C212  100nF  C0603  [CAPC1608X85]
C213  22uF/25V  C1206  [CAPC3216X135]
C214  100nF  C0603  [CAPC1608X85]
C215  100nF  C0402  [CAPC1005_0402]
C216  100nF  C0402  [CAPC1005_0402]
C217  22uF/25V  C1206  [CAPC3216X135]
C218  22uF/25V  C1206  [CAPC3216X135]
C219  22uF/25V  C1206  [CAPC3216X135]
C220  22uF/25V  C1206  [CAPC3216X135]
C221  22uF/25V  C1206  [CAPC3216X135]
C222  22nF  C0402  [CAPC1005_0402]
C223  100pF  C0402  [CAPC1005_0402]
C224  100nF  C0402  [CAPC1005_0402]
L20  4.7uH/9.5A  L7070  [IHLP4040DZ_01_4R7]
R210  100k  R0603  [RESC1608X60]
R211  23.2k  R0603  [RESC1608X60]
R212  49.9k  R0603  [RESC1608X60]
R213  18mR/1W  R1206  [RESC3216X70]
R214  100R  R0603  [RESC1608X60]
R215  100R  R0603  [RESC1608X60]
R216  100k  R0603  [RESC1608X60]
R217  24.9k  R0603  [RESC1608X60]
R218  3.3k  R0402  [RESC1005_0402]
U20  TPS55289RYQR  [TI_RYQ0021A]

### Nets
FAN_BAT: C210.1 C211.1 C212.1 R210.1 U20.7(VIN) ; also sheet 7,9
FAN_BOOT1_6V: C214.1 U20.20(BOOT1)
FAN_BOOT2_6V: C215.1 U20.19(BOOT2)
FAN_COMP_6V: C223.1 R218.1 U20.15(COMP)
FAN_COMP_RC: C222.1 R218.2
FAN_EN_6V: R210.2 R211.1 U20.1(EN)
FAN_FB_6V: R216.2 R217.1 U20.14(FB)
FAN_FSW_6V: R212.1 U20.6(FSW)
FAN_ISN_6V: C216.2 R215.2 U20.13(ISN)
FAN_ISP_6V: C216.1 R214.2 U20.12(ISP)
FAN_SW1_6V: C214.2 L20.1 U20.8(SW1)
FAN_SW2_6V: C215.2 L20.2 U20.10(SW2)
FAN_V_EXT: C221.1 R213.2 R215.1 R216.1 ; also sheet 7
FAN_VCC_6V: C213.1 U20.18(VCC) U20.21(EXTVCC)
FAN_VM_RAW: C217.1 C218.1 C219.1 C220.1 C224.1 R213.1 R214.1 U20.11(VOUT)
GND: C210.2 C211.2 C212.2 C213.2 C217.2 C218.2 C219.2 C220.2 C221.2 C222.2 C223.2 C224.2 R211.2 R212.2 R217.2 U20.2(MODE) U20.5(DITH) U20.9(PGND) U20.9A(PGND) U20.17(AGND) ; also sheet 1,2,3,4,5,6,7,9,10,11,12,13,14
GPIO40: U20.3(SCL) ; also sheet 1,4,10
GPIO41: U20.4(SDA) ; also sheet 1,4,10
Unconnected: U20.16(CDC)

### Notes on the sheet
- ROBOTRACERS 2026 | POTENCIA REV E
- 6V TURBINA / BUCK-BOOST INDEPENDIENTE
- 400 kHz FPWM. EXTVCC y CDC NC. VOUT = 6.019 V nominal.
- UVLO: ~6.53 V ON / ~5.98 V OFF. R213=18 mOhm/1 W, C50314717; limite nominal 2.78 A. Medir arranque turbina.
- U20 TPS55289: I2C 0x75; firmware configura 6V y habilita salida.
- ESQUEMA EN INTEGRACION - VALIDAR TERMICA Y TRANSITORIOS ANTES DE PCBA

## Sheet 9 of 14: ENTRADA BATERIA 2S / XT30 PCB
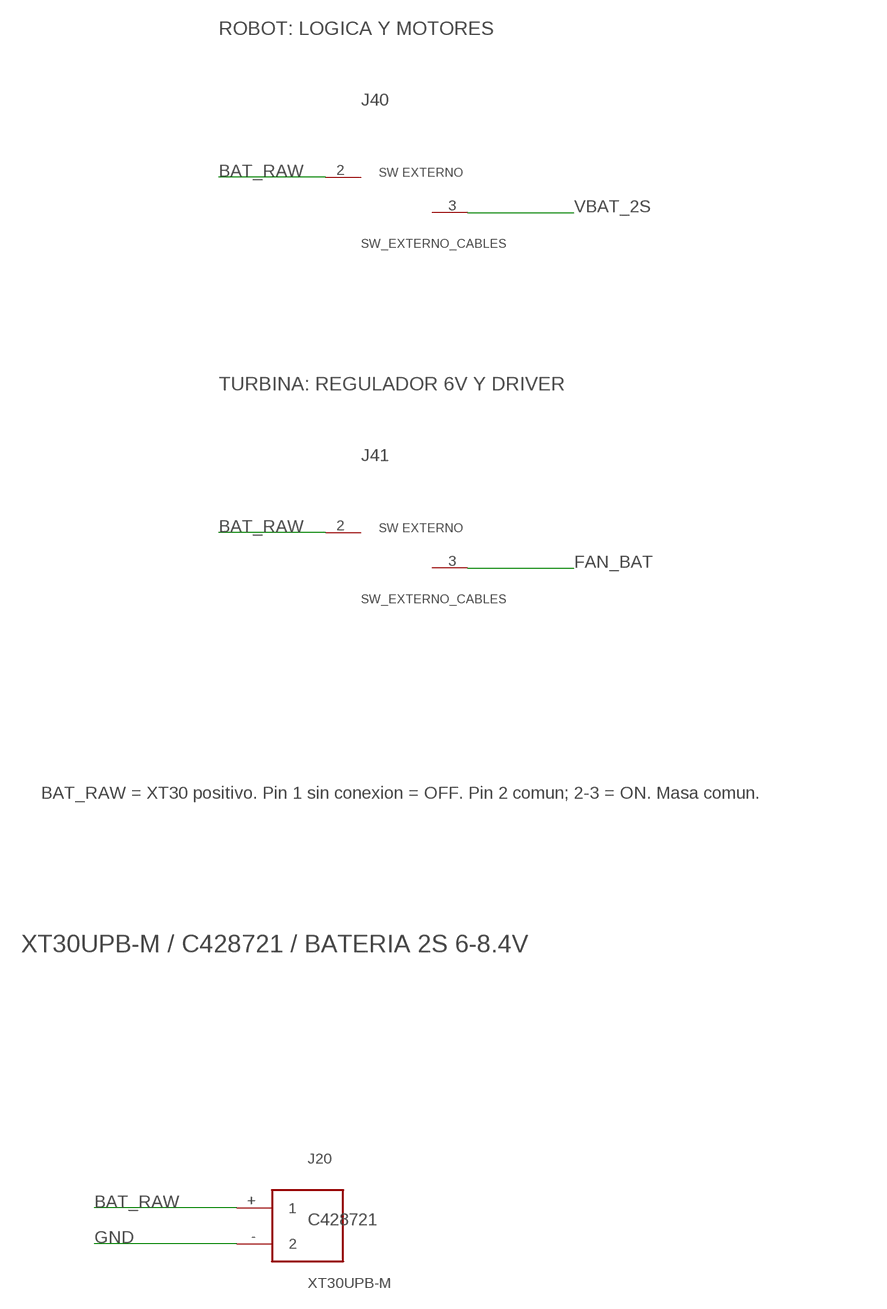
[diagram p8: schematic, sheet 9]

### Parts
J20  XT30UPB-M  XT30PW-M30.G.Y  [XT30UPB-M]
J40  SW_EXTERNO_CABLES  WIRE_SWITCH_2P  [WIRE_SWITCH_2P]
J41  SW_EXTERNO_CABLES  WIRE_SWITCH_2P  [WIRE_SWITCH_2P]

### Nets
BAT_RAW: J20.+ J40.2(COM) J41.2(COM)
FAN_BAT: J41.3(ON) ; also sheet 7,8
GND: J20.- ; also sheet 1,2,3,4,5,6,7,8,10,11,12,13,14
VBAT_2S: J40.3(ON) ; also sheet 4,13

### Notes on the sheet
- ROBOT: LOGICA Y MOTORES
- TURBINA: REGULADOR 6V Y DRIVER
- BAT_RAW = XT30 positivo. Pin 1 sin conexion = OFF. Pin 2 comun; 2-3 = ON. Masa comun.
- XT30UPB-M / C428721 / BATERIA 2S 6-8.4V

## Sheet 10 of 14: IMU SPI / ICM-42688-P
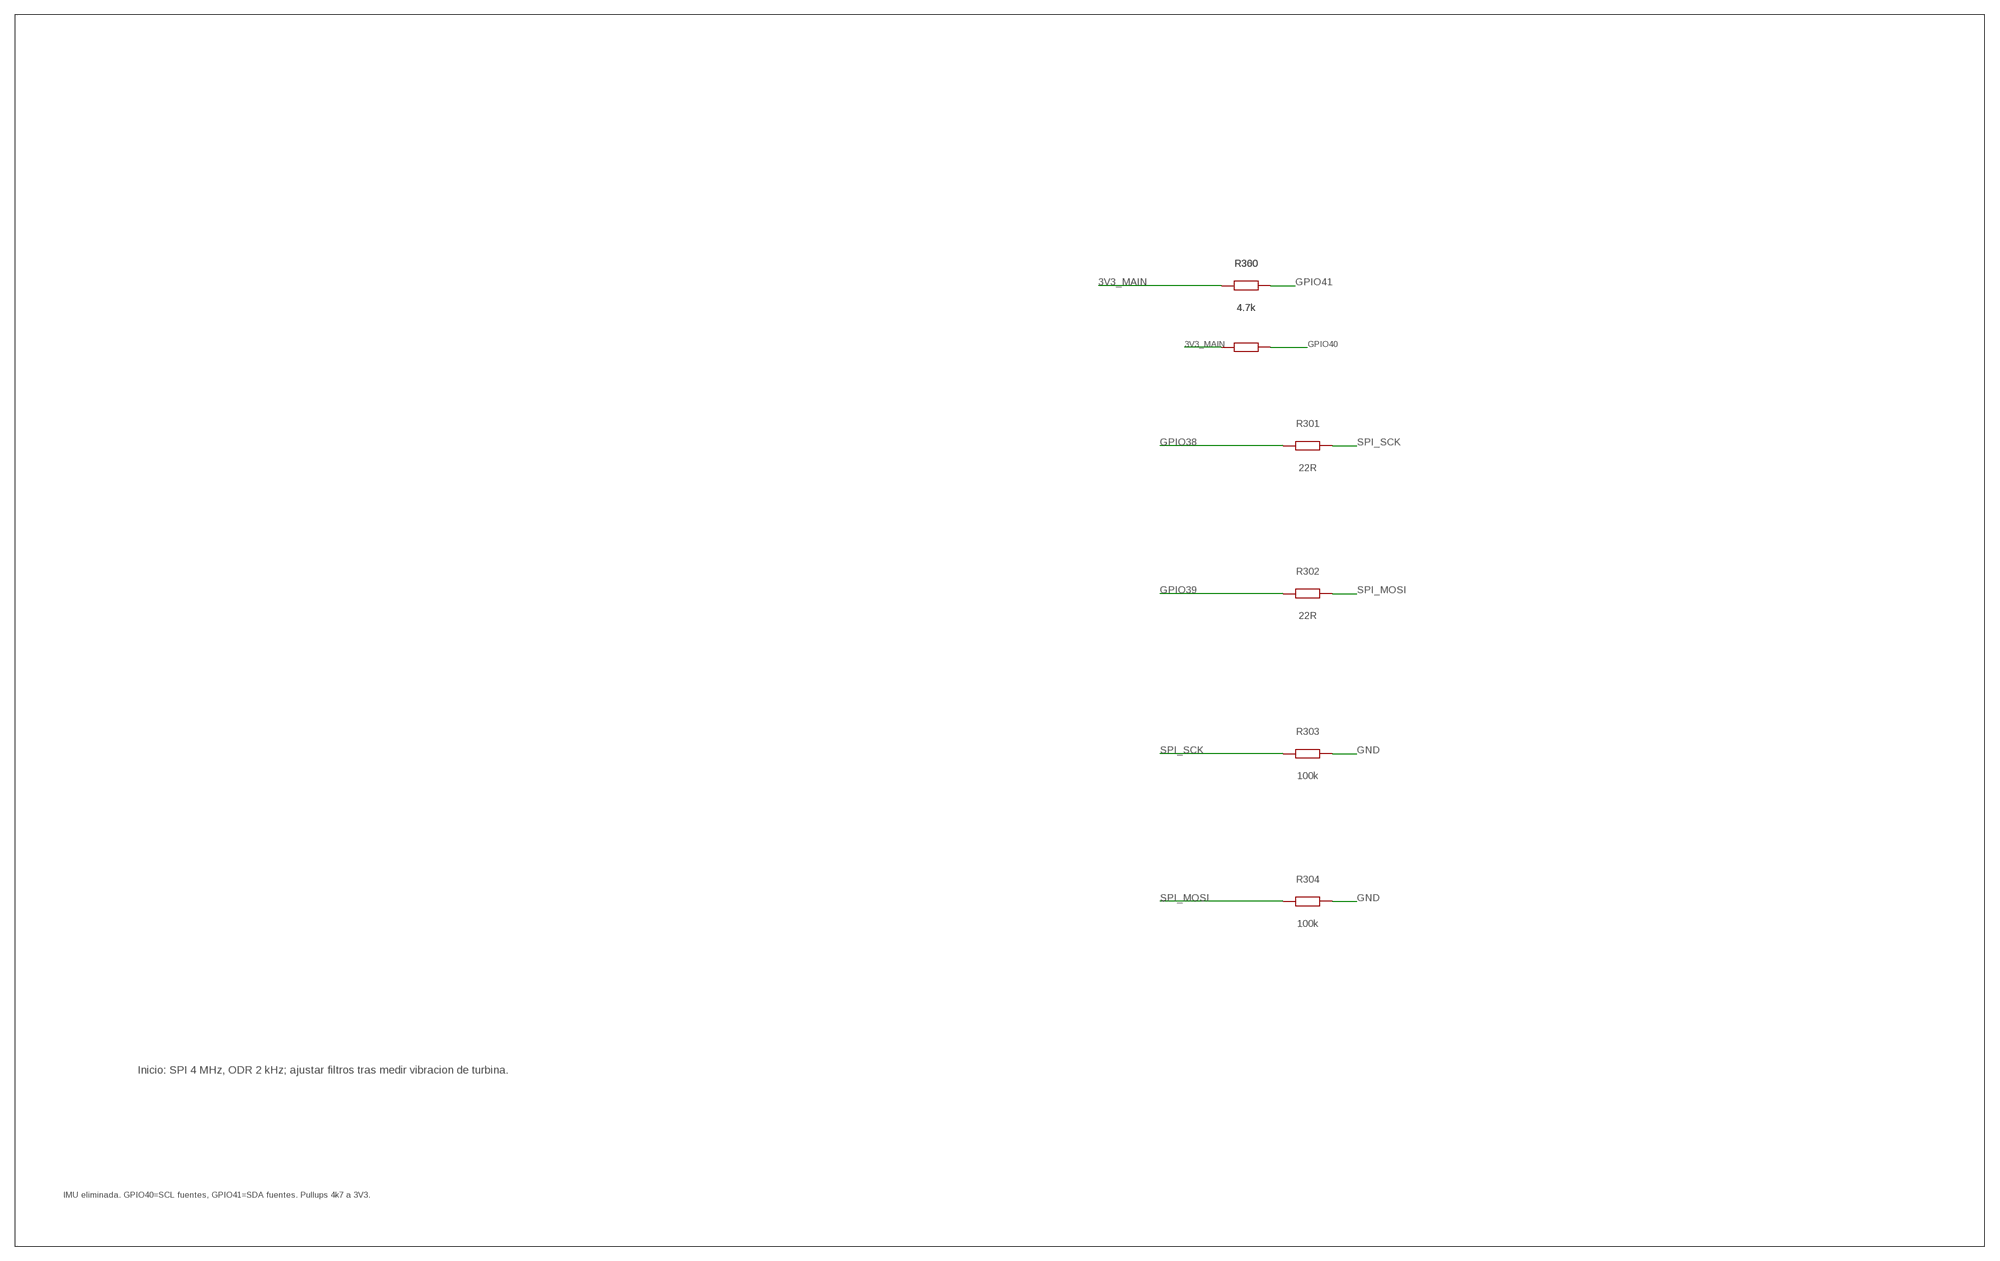
[diagram p9: schematic, sheet 10]

### Parts
R300  4.7k  R0603  [RESC1608X60]
R301  22R  R0603  [RESC1608X60]
R302  22R  R0603  [RESC1608X60]
R303  100k  R0603  [RESC1608X60]
R304  100k  R0603  [RESC1608X60]
R360  4.7k  R0603  [RESC1608X60]

### Nets
3V3_MAIN: R300.1 R360.1 ; also sheet 1,2,3,5,6,11,12,13,14
GND: R303.2 R304.2 ; also sheet 1,2,3,4,5,6,7,8,9,11,12,13,14
GPIO38: R301.1 ; also sheet 1
GPIO39: R302.1 ; also sheet 1
GPIO40: R360.2 ; also sheet 1,4,8
GPIO41: R300.2 ; also sheet 1,4,8
SPI_MOSI: R302.2 R304.1 ; also sheet 11
SPI_SCK: R301.2 R303.1 ; also sheet 11

### Notes on the sheet
- Inicio: SPI 4 MHz, ODR 2 kHz; ajustar filtros tras medir vibracion de turbina.
- IMU eliminada. GPIO40=SCL fuentes, GPIO41=SDA fuentes. Pullups 4k7 a 3V3.

## Sheet 11 of 14: REGLETA CON MUX EXTERNO / SENSORES LATERALES
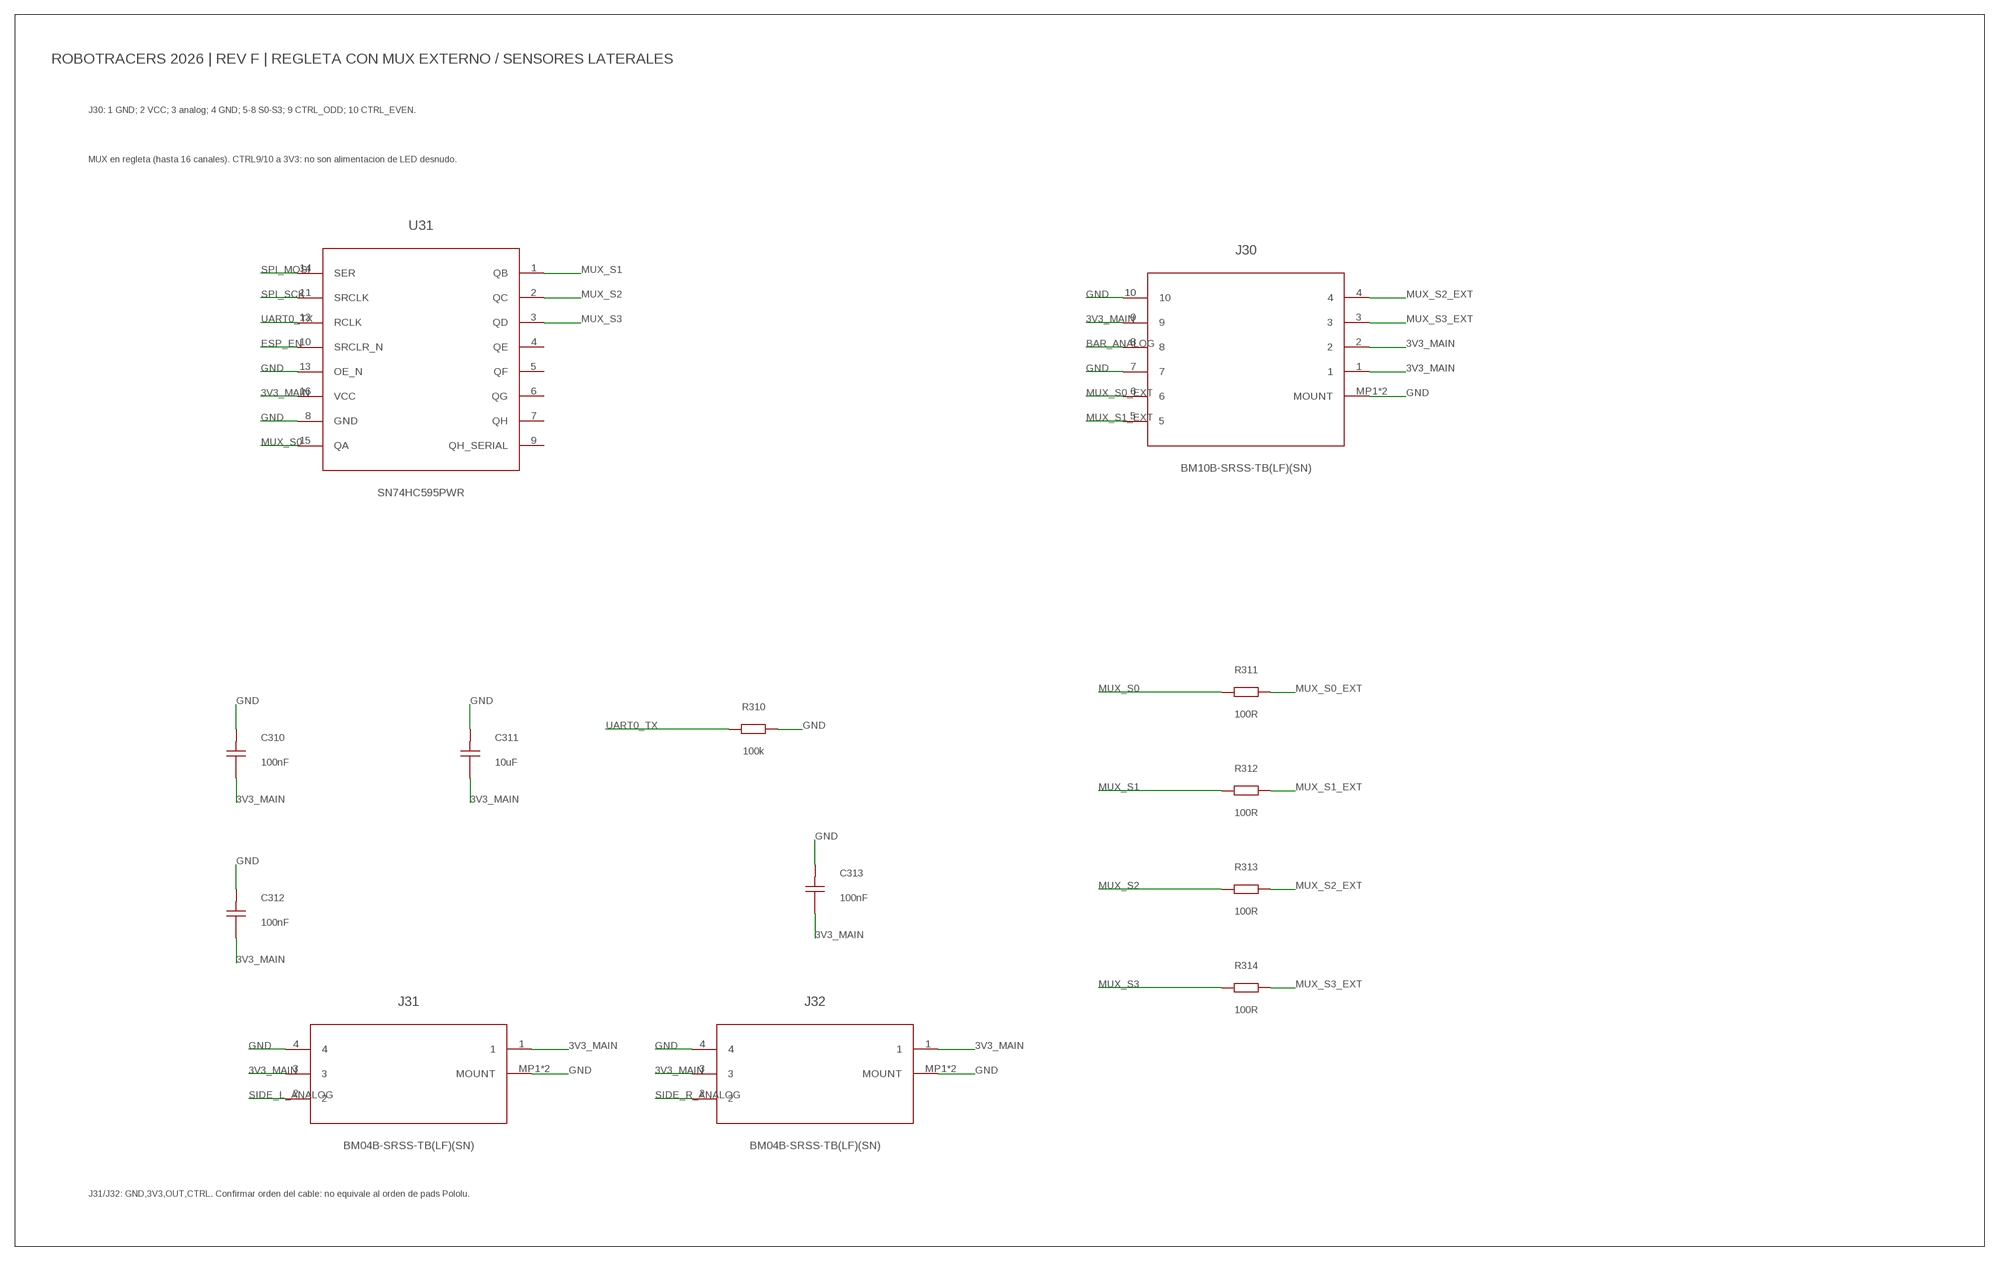
[diagram p10: schematic, sheet 11]

### Parts
C310  100nF  C0603  [CAPC1608X85]
C311  10uF  C0805  [CAPC2012X110]
C312  100nF  C0603  [CAPC1608X85]
C313  100nF  C0603  [CAPC1608X85]
J30  BM10B-SRSS-TB(LF)(SN)  JST_SH_10  [JST_SH_10]
J31  BM04B-SRSS-TB(LF)(SN)  JST_SH_4  [JST_SH_4]
J32  BM04B-SRSS-TB(LF)(SN)  JST_SH_4  [JST_SH_4]
R310  100k  R0603  [RESC1608X60]
R311  100R  R0603  [RESC1608X60]
R312  100R  R0603  [RESC1608X60]
R313  100R  R0603  [RESC1608X60]
R314  100R  R0603  [RESC1608X60]
U31  SN74HC595PWR  [TSSOP16_PW]

### Nets
3V3_MAIN: C310.1 C311.1 C312.1 C313.1 J30.1 J30.2 J30.9 J31.1 J31.3 J32.1 J32.3 U31.16(VCC) ; also sheet 1,2,3,5,6,10,12,13,14
BAR_ANALOG: J30.8 ; also sheet 14
ESP_EN: U31.10(SRCLR_N) ; also sheet 1
GND: C310.2 C311.2 C312.2 C313.2 J30.7 J30.10 J30.MP1(MOUNT) J30.MP2(MOUNT) J31.4 J31.MP1(MOUNT) J31.MP2(MOUNT) J32.4 J32.MP1(MOUNT) J32.MP2(MOUNT) R310.2 U31.8(GND) U31.13(OE_N) ; also sheet 1,2,3,4,5,6,7,8,9,10,12,13,14
MUX_S0: R311.1 U31.15(QA)
MUX_S0_EXT: J30.6 R311.2
MUX_S1: R312.1 U31.1(QB)
MUX_S1_EXT: J30.5 R312.2
MUX_S2: R313.1 U31.2(QC)
MUX_S2_EXT: J30.4 R313.2
MUX_S3: R314.1 U31.3(QD)
MUX_S3_EXT: J30.3 R314.2
SIDE_L_ANALOG: J31.2 ; also sheet 14
SIDE_R_ANALOG: J32.2 ; also sheet 14
SPI_MOSI: U31.14(SER) ; also sheet 10
SPI_SCK: U31.11(SRCLK) ; also sheet 10
UART0_TX: R310.1 U31.12(RCLK) ; also sheet 1
Unconnected: U31.4(QE) U31.5(QF) U31.6(QG) U31.7(QH) U31.9(QH_SERIAL)

### Notes on the sheet
- ROBOTRACERS 2026 | REV F | REGLETA CON MUX EXTERNO / SENSORES LATERALES
- J30: 1 GND; 2 VCC; 3 analog; 4 GND; 5-8 S0-S3; 9 CTRL_ODD; 10 CTRL_EVEN.
- MUX en regleta (hasta 16 canales). CTRL9/10 a 3V3: no son alimentacion de LED desnudo.
- J31/J32: GND,3V3,OUT,CTRL. Confirmar orden del cable: no equivale al orden de pads Pololu.

## Sheet 12 of 14: RGB / BOTONES / BUZZER
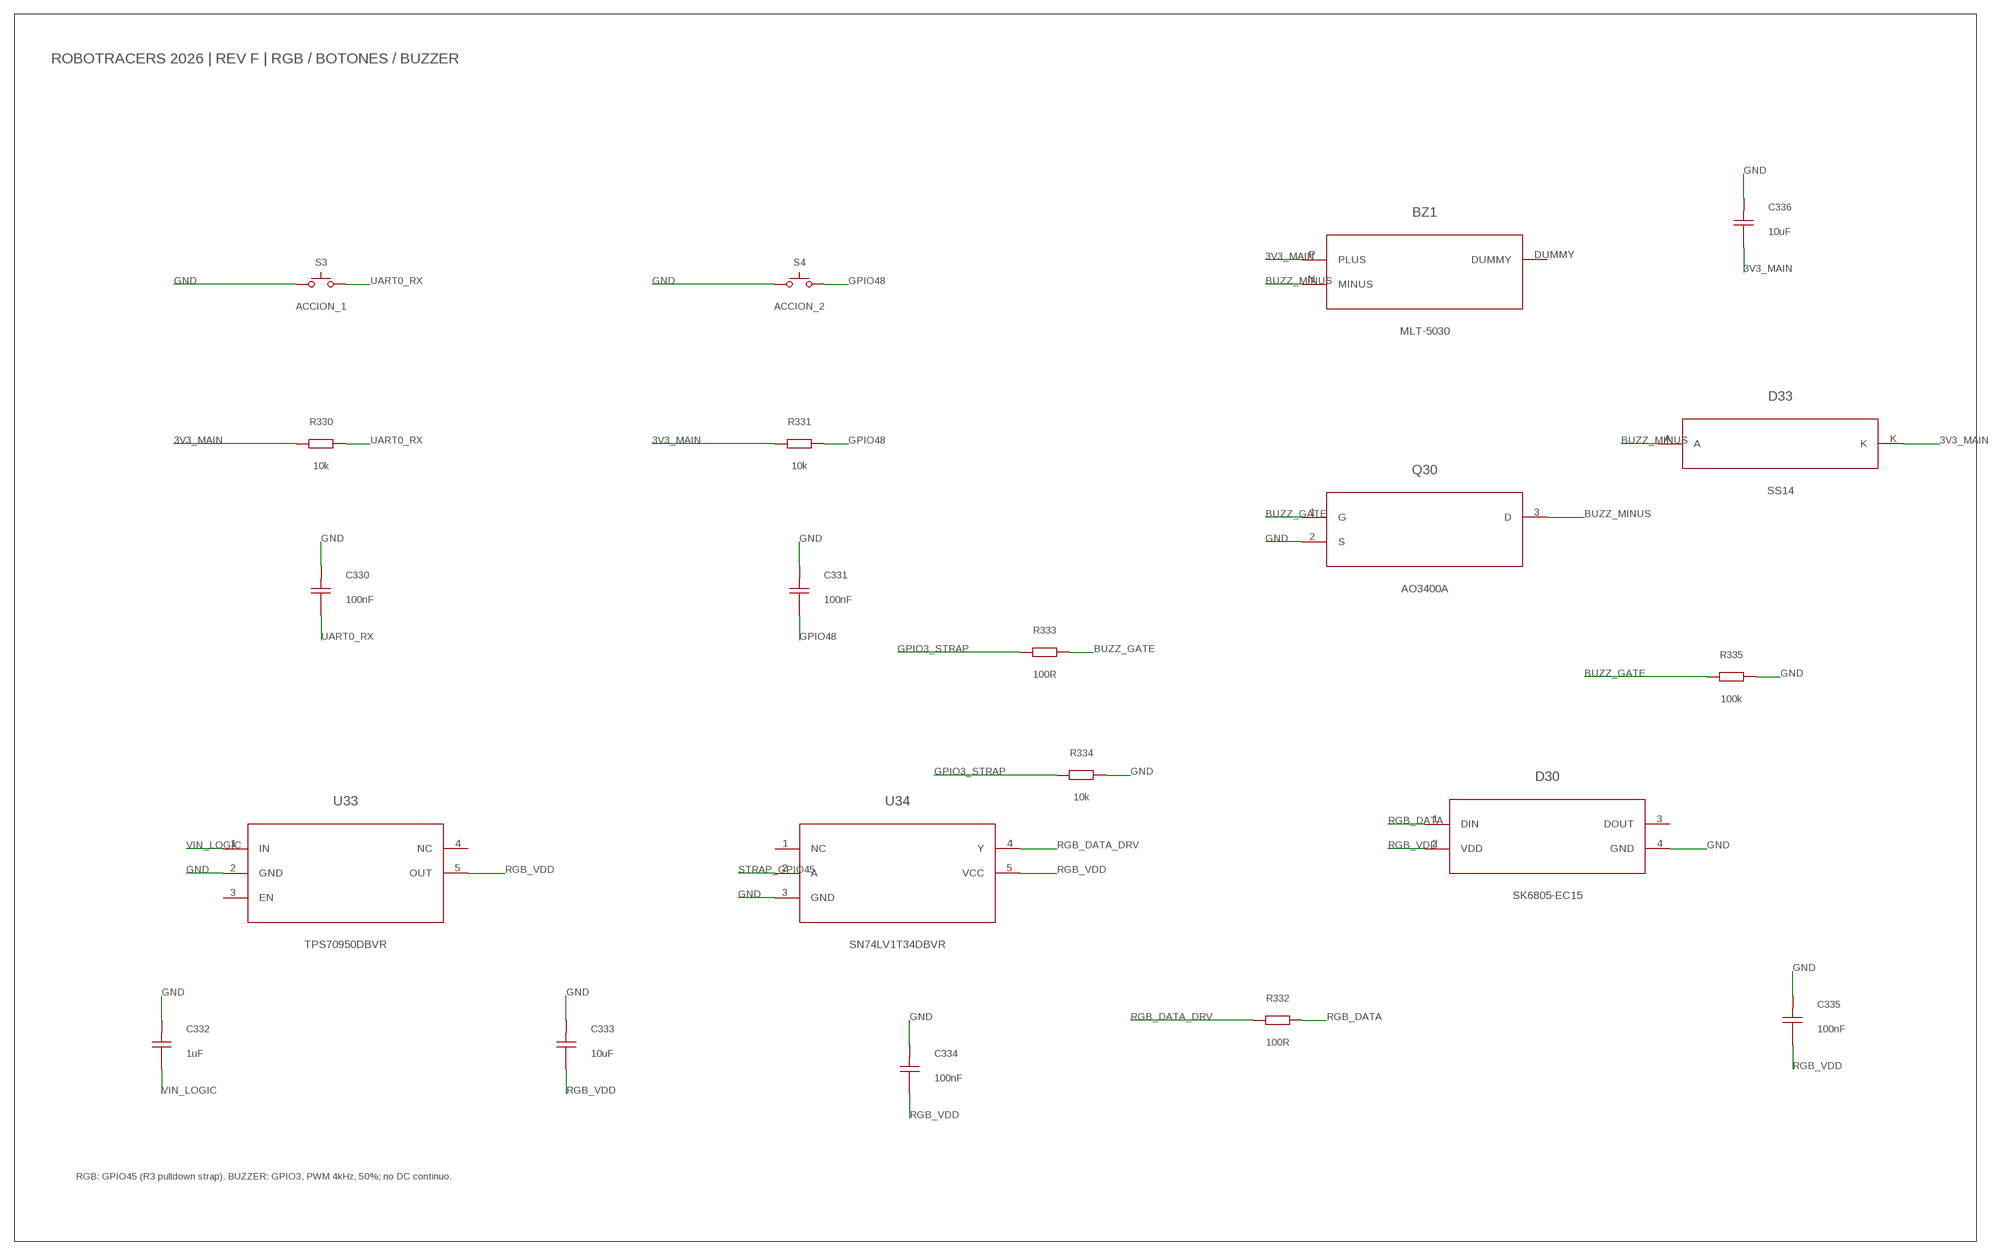
[diagram p11: schematic, sheet 12]

### Parts
BZ1  MLT-5030  [MLT5030]
C330  100nF  C0603  [CAPC1608X85]
C331  100nF  C0603  [CAPC1608X85]
C332  1uF  C0603  [CAPC1608X85]
C333  10uF  C0805  [CAPC2012X110]
C334  100nF  C0603  [CAPC1608X85]
C335  100nF  C0603  [CAPC1608X85]
C336  10uF  C0805  [CAPC2012X110]
D30  SK6805-EC15  [SK6805_EC15]
D33  SS14  [SS14]
Q30  AO3400A  [SOT95P237X112-3N]
R330  10k  R0603  [RESC1608X60]
R331  10k  R0603  [RESC1608X60]
R332  100R  R0603  [RESC1608X60]
R333  100R  R0603  [RESC1608X60]
R334  10k  R0603  [RESC1608X60]
R335  100k  R0603  [RESC1608X60]
S3  ACCION_1  BUTTON  [B3U-1000P(M)]
S4  ACCION_2  BUTTON  [B3U-1000P(M)]
U33  TPS70950DBVR  [SOT95P280X145-5N]
U34  SN74LV1T34DBVR  [SOT95P280X145-5N]

### Nets
3V3_MAIN: BZ1.P(PLUS) C336.1 D33.K R330.1 R331.1 ; also sheet 1,2,3,5,6,10,11,13,14
BUZZ_GATE: Q30.1(G) R333.2 R335.1
BUZZ_MINUS: BZ1.N(MINUS) D33.A Q30.3(D)
GND: C330.2 C331.2 C332.2 C333.2 C334.2 C335.2 C336.2 D30.4(GND) Q30.2(S) R334.2 R335.2 S3.1 S4.1 U33.2(GND) U34.3(GND) ; also sheet 1,2,3,4,5,6,7,8,9,10,11,13,14
GPIO3_STRAP: R333.1 R334.1 ; also sheet 1
GPIO48: C331.1 R331.2 S4.2 ; also sheet 1
RGB_DATA: D30.1(DIN) R332.2
RGB_DATA_DRV: R332.1 U34.4(Y)
RGB_VDD: C333.1 C334.1 C335.1 D30.2(VDD) U33.5(OUT) U34.5(VCC) ; also sheet 13
STRAP_GPIO45: U34.2(A) ; also sheet 1
UART0_RX: C330.1 R330.2 S3.2 ; also sheet 1
VIN_LOGIC: C332.1 U33.1(IN) ; also sheet 3,13
Unconnected: BZ1.DUMMY D30.3(DOUT) U33.3(EN) U33.4(NC) U34.1(NC)

### Notes on the sheet
- ROBOTRACERS 2026 | REV F | RGB / BOTONES / BUZZER
- RGB: GPIO45 (R3 pulldown strap). BUZZER: GPIO3, PWM 4kHz, 50%; no DC continuo.

## Sheet 13 of 14: ALIMENTACION LOGICA DESDE USB / RESERVA Y PROTECCION
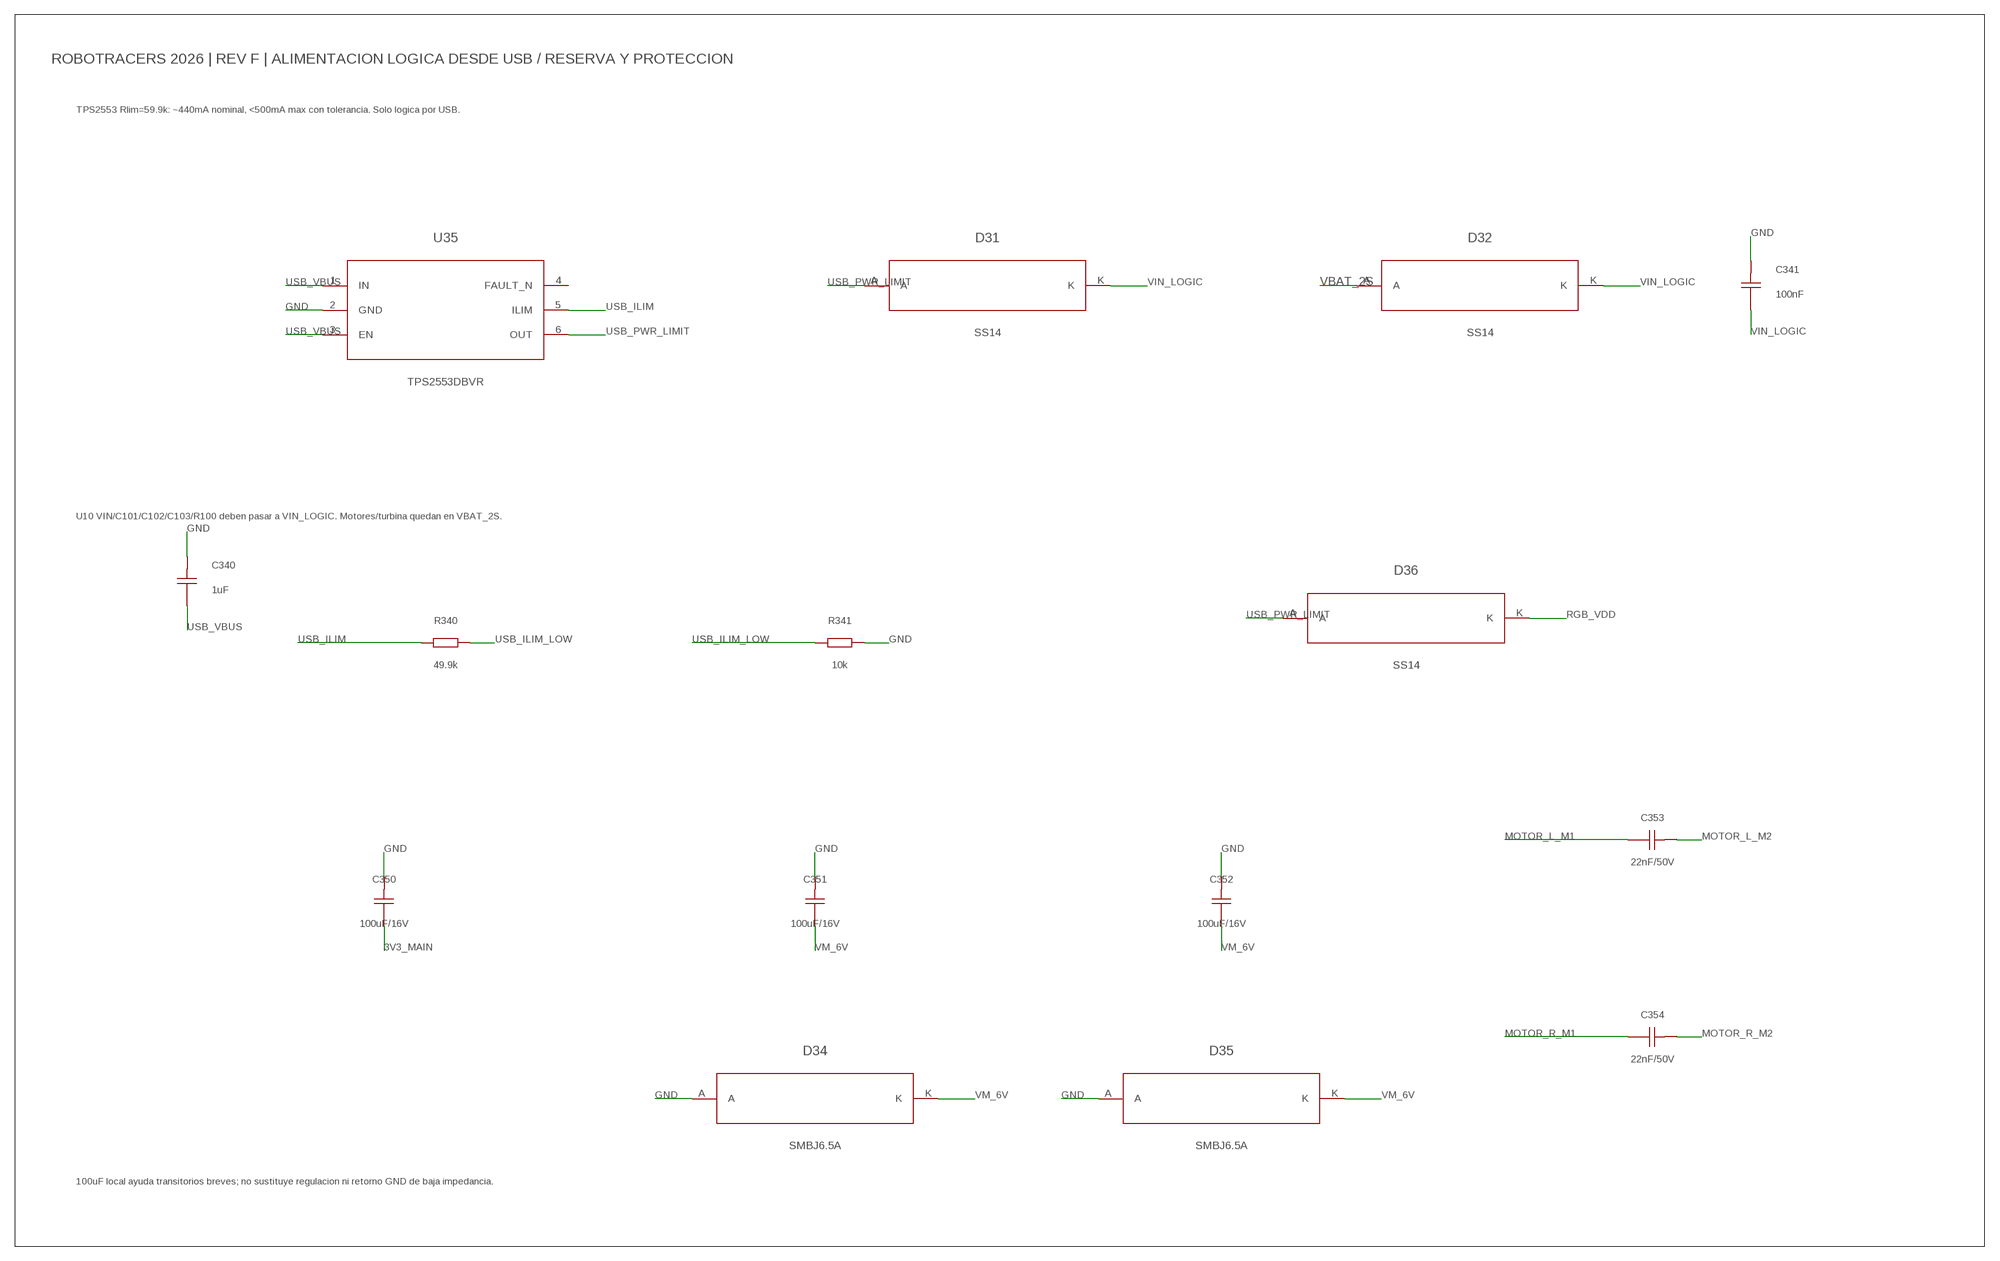
[diagram p12: schematic, sheet 13]

### Parts
C340  1uF  C0603  [CAPC1608X85]
C341  100nF  C0603  [CAPC1608X85]
C350  100uF/16V  C100UF  [CAPAE660X540N]
C351  100uF/16V  C100UF  [CAPAE660X540N]
C352  100uF/16V  C100UF  [CAPAE660X540N]
C353  22nF/50V  C0603  [CAPC1608X85]
C354  22nF/50V  C0603  [CAPC1608X85]
D31  SS14  [SS14]
D32  SS14  [SS14]
D34  SMBJ6.5A  [SMBJ6.5A]
D35  SMBJ6.5A  [SMBJ6.5A]
D36  SS14  [SS14]
R340  49.9k  R0603  [RESC1608X60]
R341  10k  R0603  [RESC1608X60]
U35  TPS2553DBVR  [SOT95P280X145-6N]

### Nets
3V3_MAIN: C350.1 ; also sheet 1,2,3,5,6,10,11,12,14
GND: C340.2 C341.2 C350.2 C351.2 C352.2 D34.A D35.A R341.2 U35.2(GND) ; also sheet 1,2,3,4,5,6,7,8,9,10,11,12,14
MOTOR_L_M1: C353.1 ; also sheet 5
MOTOR_L_M2: C353.2 ; also sheet 5
MOTOR_R_M1: C354.1 ; also sheet 6
MOTOR_R_M2: C354.2 ; also sheet 6
RGB_VDD: D36.K ; also sheet 12
USB_ILIM: R340.1 U35.5(ILIM)
USB_ILIM_LOW: R340.2 R341.1
USB_PWR_LIMIT: D31.A D36.A U35.6(OUT)
USB_VBUS: C340.1 U35.1(IN) U35.3(EN) ; also sheet 2
VBAT_2S: D32.A ; also sheet 4,9
VIN_LOGIC: C341.1 D31.K D32.K ; also sheet 3,12
VM_6V: C351.1 C352.1 D34.K D35.K ; also sheet 4,5,6
Unconnected: U35.4(FAULT_N)

### Notes on the sheet
- ROBOTRACERS 2026 | REV F | ALIMENTACION LOGICA DESDE USB / RESERVA Y PROTECCION
- TPS2553 Rlim=59.9k: ~440mA nominal, <500mA max con tolerancia. Solo logica por USB.
- U10 VIN/C101/C102/C103/R100 deben pasar a VIN_LOGIC. Motores/turbina quedan en VBAT_2S.
- 100uF local ayuda transitorios breves; no sustituye regulacion ni retorno GND de baja impedancia.

## Sheet 14 of 14: ACONDICIONAMIENTO ANALOGICO / ADC1
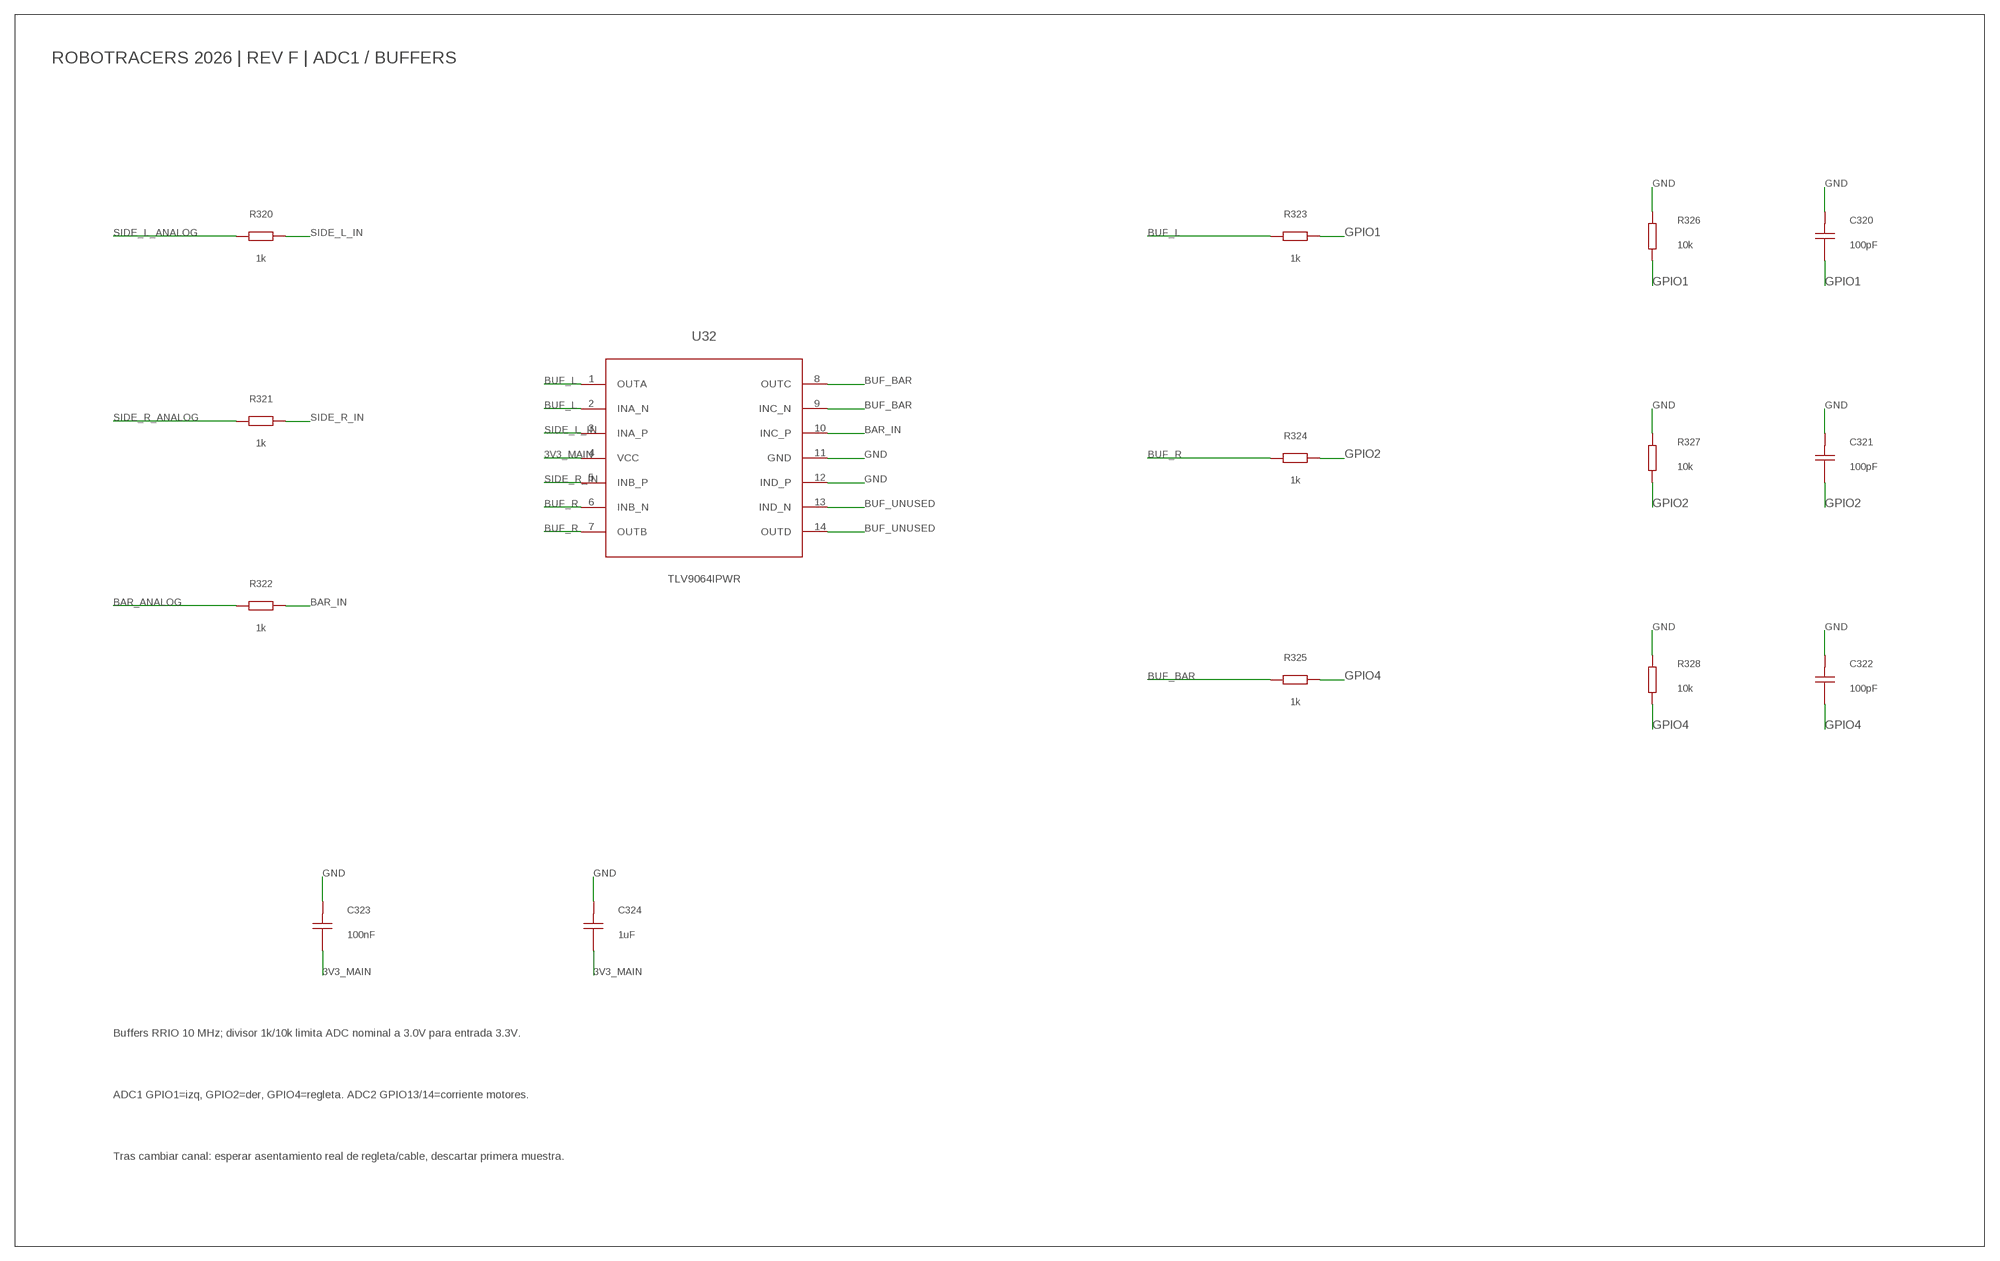
[diagram p13: schematic, sheet 14]

### Parts
C320  100pF  C0603  [CAPC1608X85]
C321  100pF  C0603  [CAPC1608X85]
C322  100pF  C0603  [CAPC1608X85]
C323  100nF  C0603  [CAPC1608X85]
C324  1uF  C0603  [CAPC1608X85]
R320  1k  R0603  [RESC1608X60]
R321  1k  R0603  [RESC1608X60]
R322  1k  R0603  [RESC1608X60]
R323  1k  R0603  [RESC1608X60]
R324  1k  R0603  [RESC1608X60]
R325  1k  R0603  [RESC1608X60]
R326  10k  R0603  [RESC1608X60]
R327  10k  R0603  [RESC1608X60]
R328  10k  R0603  [RESC1608X60]
U32  TLV9064IPWR  [SOP65P640X120-14]

### Nets
3V3_MAIN: C323.1 C324.1 U32.4(VCC) ; also sheet 1,2,3,5,6,10,11,12,13
BAR_ANALOG: R322.1 ; also sheet 11
BAR_IN: R322.2 U32.10(INC_P)
BUF_BAR: R325.1 U32.8(OUTC) U32.9(INC_N)
BUF_L: R323.1 U32.1(OUTA) U32.2(INA_N)
BUF_R: R324.1 U32.6(INB_N) U32.7(OUTB)
BUF_UNUSED: U32.13(IND_N) U32.14(OUTD)
GND: C320.2 C321.2 C322.2 C323.2 C324.2 R326.2 R327.2 R328.2 U32.11(GND) U32.12(IND_P) ; also sheet 1,2,3,4,5,6,7,8,9,10,11,12,13
GPIO1: C320.1 R323.2 R326.1 ; also sheet 1
GPIO2: C321.1 R324.2 R327.1 ; also sheet 1
GPIO4: C322.1 R325.2 R328.1 ; also sheet 1
SIDE_L_ANALOG: R320.1 ; also sheet 11
SIDE_L_IN: R320.2 U32.3(INA_P)
SIDE_R_ANALOG: R321.1 ; also sheet 11
SIDE_R_IN: R321.2 U32.5(INB_P)

### Notes on the sheet
- ROBOTRACERS 2026 | REV F | ADC1 / BUFFERS
- Buffers RRIO 10 MHz; divisor 1k/10k limita ADC nominal a 3.0V para entrada 3.3V.
- ADC1 GPIO1=izq, GPIO2=der, GPIO4=regleta. ADC2 GPIO13/14=corriente motores.
- Tras cambiar canal: esperar asentamiento real de regleta/cable, descartar primera muestra.

## Library data of the parts
BZ1 = RobotRacers_Perifericos_RevF:MLT-5030: MLT-5030; DATASHEET: https://ch405-labs.com/content/files/2024/09/2108131530_Jiangsu-Huaneng-Elec-MLT-5030_C95297.pdf; JLCPCB_PART: C95297; JLCPCB_URL: https://jlcpcb.com/partdetail/MLT-5030/C95297; LCSC_PART: C95297; MANUFACTURER: Jiangsu Huaneng Elec; MPN: MLT-5030; POPULATE: YES
C1 = RobotRacers_ESP32S3_Core:C0805: GRM21BR71A106KE51L; JLCPCB_PART: C86038; JLCPCB_URL: https://jlcpcb.com/partdetail/GRM21BR71A106KE51L/C86038; LCSC_PART: C86038; MANUFACTURER: Murata; MPN: GRM21BR71A106KE51L; POPULATE: YES
C2 C4 = RobotRacers_ESP32S3_Core:C0603: specified per instance; JLCPCB_PART: C45000; JLCPCB_URL: https://jlcpcb.com/partdetail/GRM188R71C104KA01D/C45000; LCSC_PART: C45000; MANUFACTURER: Murata; MPN: GRM188R71C104KA01D; POPULATE: YES
C3 = RobotRacers_ESP32S3_Core:C0603: specified per instance; JLCPCB_PART: C108463; JLCPCB_URL: https://jlcpcb.com/partdetail/GRM188R71A105KA61D/C97888; LCSC_PART: C108463; MANUFACTURER: Murata; MPN: 0603B105K160CT; POPULATE: YES
C5 C6 = RobotRacers_ESP32S3_Core:C0603: specified per instance; JLCPCB_PART: C84498; JLCPCB_URL: https://jlcpcb.com/partdetail/GRM1885C1H100JA01D/C84498; LCSC_PART: C84498; MANUFACTURER: Murata; MPN: GRM1885C1H100JA01D; POPULATE: NO
C100 C103 C104 C112 C114-C116 C130 C133 C134 C136 C150 C153 C154 C156 C170 C174 = RobotRacers_Power_RevD:C0603: per instance; JLCPCB_PART: C45000; JLCPCB_URL: https://jlcpcb.com/partdetail/GRM188R71C104KA01D/C45000; LCSC_PART: C45000; MPN: GRM188R71C104KA01D; POPULATE: YES
C101 C102 C105 C106 C110 C111 C113 C117-C121 C132 C152 C171-C173 = RobotRacers_Power_RevD:C1206: per instance; JLCPCB_PART: C12891; JLCPCB_URL: https://jlcpcb.com/partdetail/CL31A226KAHNNNE/C12891; LCSC_PART: C12891; MPN: CL31A226KAHNNNE; POPULATE: YES
C122 C124 C215 C216 C224 = RobotRacers_RevQ_Passives:C0402; JLCPCB_PART: C1525; JLCPCB_URL: https://jlcpcb.com/partdetail/CL05B104KO5NNNC/C1525; LCSC_PART: C1525; MANUFACTURER: Samsung Electro-Mechanics; MPN: CL05B104KO5NNNC; POPULATE: YES
C123 C223 = RobotRacers_RevQ_Passives:C0402; JLCPCB_PART: C1546; JLCPCB_URL: https://jlcpcb.com/partdetail/0402CG101J500NT/C1546; LCSC_PART: C1546; MANUFACTURER: FH; MPN: 0402CG101J500NT; POPULATE: YES
C131 C151 = RobotRacers_Power_RevD:C0603: per instance; JLCPCB_PART: C1589; JLCPCB_URL: https://jlcpcb.com/partdetail/CL10B103KB8NNNC/C1589; LCSC_PART: C1589; MPN: CL10B103KB8NNNC; POPULATE: YES
C135 C155 = RobotRacers_Power_RevD:C0603: per instance; JLCPCB_PART: C21122; JLCPCB_URL: https://jlcpcb.com/partdetail/CL10B223KB8NNNC/C21122; LCSC_PART: C21122; MPN: CL10B223KB8NNNC; POPULATE: YES
C210 C211 C213 C217-C221 = RobotRacers_RevE_Power:C1206: per instance; JLCPCB_PART: C12891; JLCPCB_URL: https://jlcpcb.com/partdetail/CL31A226KAHNNNE/C12891; LCSC_PART: C12891; MPN: CL31A226KAHNNNE; POPULATE: YES
C212 C214 = RobotRacers_RevE_Power:C0603: per instance; JLCPCB_PART: C45000; JLCPCB_URL: https://jlcpcb.com/partdetail/GRM188R71C104KA01D/C45000; LCSC_PART: C45000; MPN: GRM188R71C104KA01D; POPULATE: YES
C222 = RobotRacers_RevQ_Passives:C0402; JLCPCB_PART: C1532; JLCPCB_URL: https://jlcpcb.com/partdetail/0402B223K500NT/C1532; LCSC_PART: C1532; MANUFACTURER: FH; MPN: 0402B223K500NT; POPULATE: YES
C310 C312 C313 C323 C330 C331 C334 C335 C341 = RobotRacers_Perifericos_RevF:C0603: per instance; JLCPCB_PART: C45000; JLCPCB_URL: https://jlcpcb.com/partdetail/GRM188R71C104KA01D/C45000; LCSC_PART: C45000; MPN: GRM188R71C104KA01D; POPULATE: YES
C311 C333 C336 = RobotRacers_Perifericos_RevF:C0805: per instance; JLCPCB_PART: C86038; JLCPCB_URL: https://jlcpcb.com/partdetail/GRM21BR71A106KE51L/C86038; LCSC_PART: C86038; MPN: GRM21BR71A106KE51L; POPULATE: YES
C320-C322 = RobotRacers_Perifericos_RevF:C0603: per instance; JLCPCB_PART: C14858; JLCPCB_URL: https://jlcpcb.com/partdetail/CL10C101JB8NNNC/C14858; LCSC_PART: C14858; MPN: CL10C101JB8NNNC; POPULATE: YES
C324 C332 C340 = RobotRacers_Perifericos_RevF:C0603: per instance; JLCPCB_PART: C108463; JLCPCB_URL: https://jlcpcb.com/partdetail/GRM188R71A105KA61D/C97888; LCSC_PART: C108463; MPN: 0603B105K160CT; POPULATE: YES
C350-C352 = RobotRacers_Perifericos_RevF:C100UF: per instance; JLCPCB_PART: C72475; JLCPCB_URL: https://jlcpcb.com/partdetail/RVT1C101M0605/C72475; LCSC_PART: C72475; MPN: RVT1C101M0605; POPULATE: YES
C353 C354 = RobotRacers_Perifericos_RevF:C0603: per instance; JLCPCB_PART: C21122; JLCPCB_URL: https://jlcpcb.com/partdetail/CL10B223KB8NNNC/C21122; LCSC_PART: C21122; MPN: CL10B223KB8NNNC; POPULATE: YES
D10 = RobotRacers_Power_RevD:SS1045: SS1045; JLCPCB_PART: C7305271; JLCPCB_URL: https://jlcpcb.com/partdetail/SS1045/C7305271; LCSC_PART: C7305271; MANUFACTURER: ShunYe; MPN: SS1045; POPULATE: YES
D30 = RobotRacers_Perifericos_RevF:SK6805-EC15: SK6805-EC15; DATASHEET: https://elioiot.com/docs/parts/SK6805-EC15.pdf; JLCPCB_PART: C2890035; JLCPCB_URL: https://jlcpcb.com/partdetail/SK6805-EC15/C2890035; LCSC_PART: C2890035; MANUFACTURER: OPSCO Optoelectronics; MPN: SK6805-EC15; POPULATE: YES
D31-D33 D36 = RobotRacers_Perifericos_RevF:SS14: SS14; JLCPCB_PART: C2480; JLCPCB_URL: https://jlcpcb.com/partdetail/SS14/C2480; LCSC_PART: C2480; MANUFACTURER: MDD; MPN: SS14; POPULATE: YES
D34 D35 = RobotRacers_Perifericos_RevF:SMBJ6.5A: SMBJ6.5A; JLCPCB_PART: C10206; JLCPCB_URL: https://jlcpcb.com/partdetail/SMBJ6.5A/C10206; LCSC_PART: C10206; MANUFACTURER: RUILON; MPN: SMBJ6.5A; POPULATE: YES
J1 = RobotRacers_ESP32S3_Core:12401832E402A: 12401832E402A; DATASHEET: https://cdn.amphenol-cs.com/media/wysiwyg/files/drawing/12401832e402a.pdf; JLCPCB_PART: C464604; JLCPCB_URL: https://jlcpcb.com/partdetail/12401832E402A/C464604; LCSC_PART: C464604; MANUFACTURER: Amphenol; MPN: 12401832E402A; POPULATE: YES
J10 J11 = RobotRacers_Power_RevD:MOTOR_JST: BM06B-SRSS-TB(LF)(SN); JLCPCB_PART: C160392; JLCPCB_URL: https://jlcpcb.com/partdetail/BM06B-SRSS-TB(LF)(SN)/C160392; LCSC_PART: C160392; MANUFACTURER: JST; MPN: BM06B-SRSS-TB(LF)(SN); POPULATE: YES
J12 = RobotRacers_Power_RevD:POWER_JST: B2P-VH(LF)(SN); JLCPCB_PART: C158012; JLCPCB_URL: https://jlcpcb.com/partdetail/Jst_SalesAmerica-B2B_XH_A_LF_SN/C158012; LCSC_PART: C158012; MANUFACTURER: JST; MPN: B2B-XH-A(LF)(SN); POPULATE: YES
J20 = RobotRacers_RevE_Power:XT30PW-M30.G.Y; JLCPCB_PART: C428721; JLCPCB_URL: https://jlcpcb.com/partdetail/XT30UPB-M/C428721; LCSC_PART: C428721; MANUFACTURER: AMASS; MPN: XT30UPB-M
J30 = RobotRacers_Perifericos_RevF:JST_SH_10: JST_SH_10; DATASHEET: https://www.jst-mfg.com/product/pdf/eng/eSH.pdf; JLCPCB_PART: C160396; JLCPCB_URL: https://jlcpcb.com/partdetail/BM10B-SRSS-TB(LF)(SN)/C160396; LCSC_PART: C160396; MANUFACTURER: JST; MPN: BM10B-SRSS-TB(LF)(SN); POPULATE: YES
J31 J32 = RobotRacers_Perifericos_RevF:JST_SH_4: JST_SH_4; DATASHEET: https://www.jst-mfg.com/product/pdf/eng/eSH.pdf; JLCPCB_PART: C160390; JLCPCB_URL: https://jlcpcb.com/partdetail/BM04B-SRSS-TB(LF)(SN)/C160390; LCSC_PART: C160390; MANUFACTURER: JST; MPN: BM04B-SRSS-TB(LF)(SN); POPULATE: YES
J40 J41 = RobotRacers_RevH_Switches:WIRE_SWITCH_2P; ASSEMBLY: WIRE PADS ONLY - DO NOT PLACE; POPULATE: NO
L10 = RobotRacers_Power_RevD:L5030: per instance; DATASHEET: https://wmsc.lcsc.com/wmsc/upload/file/pdf/v2/lcsc/2304140030_YJYCOIN-YSPI0530-4R7M_C351098.pdf; JLCPCB_PART: C351098; JLCPCB_URL: https://jlcpcb.com/partdetail/YSPI0530-4R7M/C351098; LCSC_PART: C351098; MANUFACTURER: YJYCOIN; MPN: YSPI0530-4R7M; POPULATE: YES
L11 = RobotRacers_Power_RevD:L7070: per instance; DATASHEET: https://www.vishay.com/docs/34193/ihlp-4040dz-01.pdf; JLCPCB_PART: C845077; JLCPCB_URL: https://jlcpcb.com/partdetail/IHLP4040DZER4R7M01/C845077; LCSC_PART: C845077; MANUFACTURER: Vishay Dale; MPN: IHLP4040DZER4R7M01; POPULATE: YES
L20 = RobotRacers_RevE_Power:L7070: per instance; DATASHEET: https://www.vishay.com/docs/34193/ihlp-4040dz-01.pdf; JLCPCB_PART: C845077; JLCPCB_URL: https://jlcpcb.com/partdetail/IHLP4040DZER4R7M01/C845077; LCSC_PART: C845077; MANUFACTURER: Vishay Dale; MPN: IHLP4040DZER4R7M01; POPULATE: YES
Q1 = RobotRacers_ESP32S3_Core:MMBT3904LT1G: MMBT3904LT1G; DATASHEET: https://www.onsemi.com/pdf/datasheet/mmbt3904lt1-d.pdf; JLCPCB_PART: C81464; JLCPCB_URL: https://jlcpcb.com/partdetail/MMBT3904LT1G/C81464; MANUFACTURER: onsemi; MPN: MMBT3904LT1G; POPULATE: YES
Q10 = RobotRacers_Power_RevD:AOD4184A: AOD4184A; DATASHEET: https://www.aosmd.com/res/data_sheets/AOD4184A.pdf; JLCPCB_PART: C99124; JLCPCB_URL: https://jlcpcb.com/partdetail/AOD4184A/C99124; LCSC_PART: C99124; MANUFACTURER: Alpha & Omega Semiconductor; MPN: AOD4184A; POPULATE: YES
Q30 = RobotRacers_Perifericos_RevF:AO3400A: AO3400A; DATASHEET: https://www.aosmd.com/sites/default/files/res/data_sheets/AO3400A.pdf; JLCPCB_PART: C20917; JLCPCB_URL: https://jlcpcb.com/partdetail/AO3400A/C20917; LCSC_PART: C20917; MANUFACTURER: Alpha & Omega Semiconductor; MPN: AO3400A; POPULATE: YES
R1-R4 R10 R12 = RobotRacers_ESP32S3_Core:R0603: specified per instance; JLCPCB_PART: C98220; JLCPCB_URL: https://jlcpcb.com/partdetail/RC0603FR-0710KL/C98220; LCSC_PART: C98220; MANUFACTURER: Yageo; MPN: RC0603FR-0710KL; POPULATE: YES
R5 = RobotRacers_ESP32S3_Core:R0603: specified per instance; JLCPCB_PART: C22548; JLCPCB_URL: https://jlcpcb.com/partdetail/RC0603FR-071KL/C22548; LCSC_PART: C22548; MANUFACTURER: Yageo; MPN: RC0603FR-071KL; POPULATE: YES
R6 R7 = RobotRacers_ESP32S3_Core:R0603: specified per instance; JLCPCB_PART: C105580; JLCPCB_URL: https://jlcpcb.com/partdetail/RC0603FR-075K1L/C105580; LCSC_PART: C105580; MANUFACTURER: Yageo; MPN: RC0603FR-075K1L; POPULATE: YES
R8 R9 = RobotRacers_ESP32S3_Core:R0603: specified per instance; JLCPCB_PART: C107701; JLCPCB_URL: https://jlcpcb.com/partdetail/RC0603FR-0722RL/C107701; LCSC_PART: C107701; MANUFACTURER: Yageo; MPN: RC0603FR-0722RL; POPULATE: YES
R11 = RobotRacers_ESP32S3_Core:R0603: specified per instance; JLCPCB_PART: C14675; JLCPCB_URL: https://jlcpcb.com/partdetail/RC0603FR-07100KL/C14675; LCSC_PART: C14675; MANUFACTURER: Yageo; MPN: RC0603FR-07100KL; POPULATE: YES
R100 R101 R110 R116 R120-R122 R140-R142 R160 R162 = RobotRacers_Power_RevD:R0603: per instance; JLCPCB_PART: C14675; JLCPCB_URL: https://jlcpcb.com/partdetail/RC0603FR-07100KL/C14675; LCSC_PART: C14675; MPN: RC0603FR-07100KL; POPULATE: YES
R102 = RobotRacers_Power_RevD:R0603: per instance; JLCPCB_PART: C114065; JLCPCB_URL: https://jlcpcb.com/partdetail/RC0603FR-0722KL/C114065; LCSC_PART: C114065; MPN: RC0603FR-0722KL; POPULATE: YES
R103 R123-R125 R143-R145 = RobotRacers_Power_RevD:R0603: per instance; JLCPCB_PART: C98220; JLCPCB_URL: https://jlcpcb.com/partdetail/RC0603FR-0710KL/C98220; LCSC_PART: C98220; MPN: RC0603FR-0710KL; POPULATE: YES
R111 = RobotRacers_Power_RevD:R0603: per instance; JLCPCB_PART: C185348; JLCPCB_URL: https://jlcpcb.com/partdetail/RC0603FR-0723K2L/C185348; LCSC_PART: C185348; MPN: RC0603FR-0723K2L; POPULATE: YES
R112 = RobotRacers_Power_RevD:R0603: per instance; JLCPCB_PART: C114624; JLCPCB_URL: https://jlcpcb.com/partdetail/RC0603FR-0749K9L/C114624; LCSC_PART: C114624; MPN: RC0603FR-0749K9L; POPULATE: YES
R113 = RobotRacers_Power_RevD:R1206: per instance; DATASHEET: https://www.yageogroup.com/content/datasheet/asset/file/PYU-PA1206_L_51_ROHS; JLCPCB_PART: C728277; JLCPCB_URL: https://jlcpcb.com/partdetail/PA1206FRE470R012L/C728277; LCSC_PART: C728277; MANUFACTURER: YAGEO; MPN: PA1206FRE470R012L; POPULATE: YES
R114 R115 = RobotRacers_Power_RevD:R0603: per instance; JLCPCB_PART: C22775; JLCPCB_URL: https://jlcpcb.com/partdetail/0603WAF1000T5E/C22775; LCSC_PART: C22775; MPN: 0603WAF1000T5E; POPULATE: YES
R117 = RobotRacers_Power_RevD:R0603: per instance; JLCPCB_PART: C137761; JLCPCB_URL: https://jlcpcb.com/partdetail/RC0603FR-0724K9L/C137761; LCSC_PART: C137761; MPN: RC0603FR-0724K9L; POPULATE: YES
R118 R218 = RobotRacers_RevQ_Passives:R0402: per instance; JLCPCB_PART: C25890; JLCPCB_URL: https://jlcpcb.com/partdetail/0402WGF3301TCE/C25890; LCSC_PART: C25890; MANUFACTURER: UNI-ROYAL; MPN: 0402WGF3301TCE; POPULATE: YES
R126 R146 = RobotRacers_Power_RevD:R0603: per instance; JLCPCB_PART: C22940; JLCPCB_URL: https://jlcpcb.com/partdetail/0603WAF2401T5E/C22940; LCSC_PART: C22940; MPN: 0603WAF2401T5E; POPULATE: YES
R127-R129 R147-R149 = RobotRacers_Power_RevD:R0603: per instance; JLCPCB_PART: C22548; JLCPCB_URL: https://jlcpcb.com/partdetail/RC0603FR-071KL/C22548; LCSC_PART: C22548; MPN: RC0603FR-071KL; POPULATE: YES
R161 = RobotRacers_Power_RevD:R0603: per instance; JLCPCB_PART: C107701; JLCPCB_URL: https://jlcpcb.com/partdetail/RC0603FR-0722RL/C107701; LCSC_PART: C107701; MPN: RC0603FR-0722RL; POPULATE: YES
R210 R216 = RobotRacers_RevE_Power:R0603: per instance; JLCPCB_PART: C14675; JLCPCB_URL: https://jlcpcb.com/partdetail/RC0603FR-07100KL/C14675; LCSC_PART: C14675; MPN: RC0603FR-07100KL; POPULATE: YES
R211 = RobotRacers_RevE_Power:R0603: per instance; JLCPCB_PART: C185348; JLCPCB_URL: https://jlcpcb.com/partdetail/RC0603FR-0723K2L/C185348; LCSC_PART: C185348; MPN: RC0603FR-0723K2L; POPULATE: YES
R212 = RobotRacers_RevE_Power:R0603: per instance; JLCPCB_PART: C114624; JLCPCB_URL: https://jlcpcb.com/partdetail/RC0603FR-0749K9L/C114624; LCSC_PART: C114624; MPN: RC0603FR-0749K9L; POPULATE: YES
R213 = RobotRacers_RevE_Power:R1206: per instance; JLCPCB_PART: C50314717; JLCPCB_URL: https://jlcpcb.com/partdetail/LRAM12CFTR018/C50314717; LCSC_PART: C50314717; MANUFACTURER: NCT; MPN: LRAM12CFTR018; POPULATE: YES
R214 R215 = RobotRacers_RevE_Power:R0603: per instance; JLCPCB_PART: C22775; JLCPCB_URL: https://jlcpcb.com/partdetail/0603WAF1000T5E/C22775; LCSC_PART: C22775; MPN: 0603WAF1000T5E; POPULATE: YES
R217 = RobotRacers_RevE_Power:R0603: per instance; JLCPCB_PART: C137761; JLCPCB_URL: https://jlcpcb.com/partdetail/RC0603FR-0724K9L/C137761; LCSC_PART: C137761; MPN: RC0603FR-0724K9L; POPULATE: YES
R300 R360 = RobotRacers_Perifericos_RevF:R0603: per instance; JLCPCB_PART: C23162; JLCPCB_URL: https://jlcpcb.com/partdetail/C23162; LCSC_PART: C23162; MPN: 0603WAF4701T5E; POPULATE: YES
R301 R302 = RobotRacers_Perifericos_RevF:R0603: per instance; JLCPCB_PART: C107701; JLCPCB_URL: https://jlcpcb.com/partdetail/RC0603FR-0722RL/C107701; LCSC_PART: C107701; MPN: RC0603FR-0722RL; POPULATE: YES
R303 R304 R310 R335 = RobotRacers_Perifericos_RevF:R0603: per instance; JLCPCB_PART: C14675; JLCPCB_URL: https://jlcpcb.com/partdetail/RC0603FR-07100KL/C14675; LCSC_PART: C14675; MPN: RC0603FR-07100KL; POPULATE: YES
R311-R314 R332 R333 = RobotRacers_Perifericos_RevF:R0603: per instance; JLCPCB_PART: C22775; JLCPCB_URL: https://jlcpcb.com/partdetail/0603WAF1000T5E/C22775; LCSC_PART: C22775; MPN: 0603WAF1000T5E; POPULATE: YES
R320-R325 = RobotRacers_Perifericos_RevF:R0603: per instance; JLCPCB_PART: C22548; JLCPCB_URL: https://jlcpcb.com/partdetail/RC0603FR-071KL/C22548; LCSC_PART: C22548; MPN: RC0603FR-071KL; POPULATE: YES
R326-R328 R330 R331 R334 R341 = RobotRacers_Perifericos_RevF:R0603: per instance; JLCPCB_PART: C98220; JLCPCB_URL: https://jlcpcb.com/partdetail/RC0603FR-0710KL/C98220; LCSC_PART: C98220; MPN: RC0603FR-0710KL; POPULATE: YES
R340 = RobotRacers_Perifericos_RevF:R0603: per instance; JLCPCB_PART: C114624; JLCPCB_URL: https://jlcpcb.com/partdetail/RC0603FR-0749K9L/C114624; LCSC_PART: C114624; MPN: RC0603FR-0749K9L; POPULATE: YES
S1 S2 = RobotRacers_ESP32S3_Core:B3U-1000PM: B3U-1000PM; DATASHEET: https://omronfs.omron.com/en_US/ecb/products/pdf/en-b3u.pdf; JLCPCB_PART: C231329; JLCPCB_URL: https://jlcpcb.com/partdetail/B3U-1000P/C231329; LCSC_PART: C231329; MANUFACTURER: Omron; MPN: B3U-1000P; POPULATE: YES
S3 S4 = RobotRacers_Perifericos_RevF:BUTTON: per instance; JLCPCB_PART: C231329; JLCPCB_URL: https://jlcpcb.com/partdetail/B3U-1000P/C231329; LCSC_PART: C231329; MPN: B3U-1000P; POPULATE: YES
U1 = RobotRacers_ESP32S3_Core:ESP32-S3-WROOM-1-N16R8: ESP32-S3-WROOM-1-N16R8; DATASHEET: https://documentation.espressif.com/esp32-s3-wroom-1_wroom-1u_datasheet_en.pdf; JLCPCB_PART: C2913202; JLCPCB_URL: https://jlcpcb.com/partdetail/ESP32-S3-WROOM-1-N16R8/C2913202; LCSC_PART: C2913202; MANUFACTURER: Espressif; MPN: ESP32-S3-WROOM-1-N16R8; POPULATE: YES
U2 = RobotRacers_ESP32S3_Core:TLV803EA30DBZR: TLV803EA30DBZR; DATASHEET: https://www.ti.com/lit/ds/symlink/tlv803e.pdf; JLCPCB_PART: C5218924; JLCPCB_URL: https://jlcpcb.com/partdetail/TLV803EA30DBZR/C5218924; LCSC_PART: C5218924; MANUFACTURER: Texas Instruments; MPN: TLV803EA30DBZR; POPULATE: YES
U3 U4 = RobotRacers_ESP32S3_Core:TPD2E2U06QDBZRQ1: TPD2E2U06QDBZRQ1; DATASHEET: https://www.ti.com/lit/ds/symlink/tpd2e2u06-q1.pdf; JLCPCB_PART: C488151; JLCPCB_URL: https://jlcpcb.com/partdetail/TPD2E2U06QDBZRQ1/C488151; LCSC_PART: C488151; MANUFACTURER: Texas Instruments; MPN: TPD2E2U06QDBZRQ1; POPULATE: YES
U10 = RobotRacers_Power_RevD:TPS62933DRLR: TPS62933DRLR; DATASHEET: https://www.ti.com/lit/ds/symlink/tps62933.pdf; JLCPCB_PART: C3200405; JLCPCB_URL: https://jlcpcb.com/partdetail/TPS62933DRLR/C3200405; LCSC_PART: C3200405; MANUFACTURER: Texas Instruments; MPN: TPS62933DRLR; POPULATE: YES
U11 = RobotRacers_Power_RevD:TPS55289RYQR: TPS552892RYQR; DATASHEET: https://www.ti.com/lit/ds/symlink/tps55289.pdf; JLCPCB_PART: C5942077; JLCPCB_URL: https://jlcpcb.com/partdetail/TPS55289RYQR/C5942077; LCSC_PART: C5942077; MANUFACTURER: Texas Instruments; MPN: TPS55289RYQR; POPULATE: YES
U12 U13 = RobotRacers_Power_RevD:DRV8874PWPR: DRV8874PWPR; DATASHEET: https://www.ti.com/lit/ds/symlink/drv8874.pdf; JLCPCB_PART: C1855818; JLCPCB_URL: https://jlcpcb.com/partdetail/DRV8874PWPR/C1855818; LCSC_PART: C1855818; MANUFACTURER: Texas Instruments; MPN: DRV8874PWPR; POPULATE: YES
U14 = RobotRacers_Power_RevD:UCC27517DBVR: UCC27517DBVR; DATASHEET: https://www.ti.com/lit/ds/symlink/ucc27517.pdf; JLCPCB_PART: C99395; JLCPCB_URL: https://jlcpcb.com/partdetail/UCC27517DBVR/C99395; LCSC_PART: C99395; MANUFACTURER: Texas Instruments; MPN: UCC27517DBVR; POPULATE: YES
U20 = RobotRacers_RevE_Power:TPS55289RYQR: TPS552892RYQR; DATASHEET: https://www.ti.com/lit/ds/symlink/tps55289.pdf; JLCPCB_PART: C5942077; JLCPCB_URL: https://jlcpcb.com/partdetail/TPS55289RYQR/C5942077; LCSC_PART: C5942077; MANUFACTURER: Texas Instruments; MPN: TPS55289RYQR; POPULATE: YES
U31 = RobotRacers_Perifericos_RevF:SN74HC595PWR: SN74HC595PWR; DATASHEET: https://www.ti.com/lit/ds/symlink/sn74hc595.pdf; JLCPCB_PART: C273642; JLCPCB_URL: https://jlcpcb.com/partdetail/SN74HC595PWR/C273642; LCSC_PART: C273642; MANUFACTURER: Texas Instruments; MPN: SN74HC595PWR; POPULATE: YES
U32 = RobotRacers_Perifericos_RevF:TLV9064IPWR: TLV9064IPWR; DATASHEET: https://www.ti.com/lit/ds/symlink/tlv9064.pdf; JLCPCB_PART: C779410; JLCPCB_URL: https://jlcpcb.com/partdetail/TLV9064IPWR/C779410; LCSC_PART: C779410; MANUFACTURER: Texas Instruments; MPN: TLV9064IPWR; POPULATE: YES
U33 = RobotRacers_Perifericos_RevF:TPS70950DBVR: TPS70950DBVR; DATASHEET: https://www.ti.com/lit/ds/symlink/tps709.pdf; JLCPCB_PART: C96028; JLCPCB_URL: https://jlcpcb.com/partdetail/TPS70950DBVR/C96028; LCSC_PART: C96028; MANUFACTURER: Texas Instruments; MPN: TPS70950DBVR; POPULATE: YES
U34 = RobotRacers_Perifericos_RevF:SN74LV1T34DBVR: SN74LV1T34DBVR; DATASHEET: https://www.ti.com/lit/ds/symlink/sn74lv1t34.pdf; JLCPCB_PART: C100024; JLCPCB_URL: https://jlcpcb.com/partdetail/SN74LV1T34DBVR/C100024; LCSC_PART: C100024; MANUFACTURER: Texas Instruments; MPN: SN74LV1T34DBVR; POPULATE: YES
U35 = RobotRacers_Perifericos_RevF:TPS2553DBVR: TPS2553DBVR; DATASHEET: https://www.ti.com/lit/ds/symlink/tps2553.pdf; JLCPCB_PART: C55266; JLCPCB_URL: https://jlcpcb.com/partdetail/TPS2553DBVR/C55266; LCSC_PART: C55266; MANUFACTURER: Texas Instruments; MPN: TPS2553DBVR; POPULATE: YES

## Net classes
0 default: width 0.127 mm, drill 0.2 mm